# Altium project Flight Controller Core PCB Version.PrjPcb (part 1 of 2)
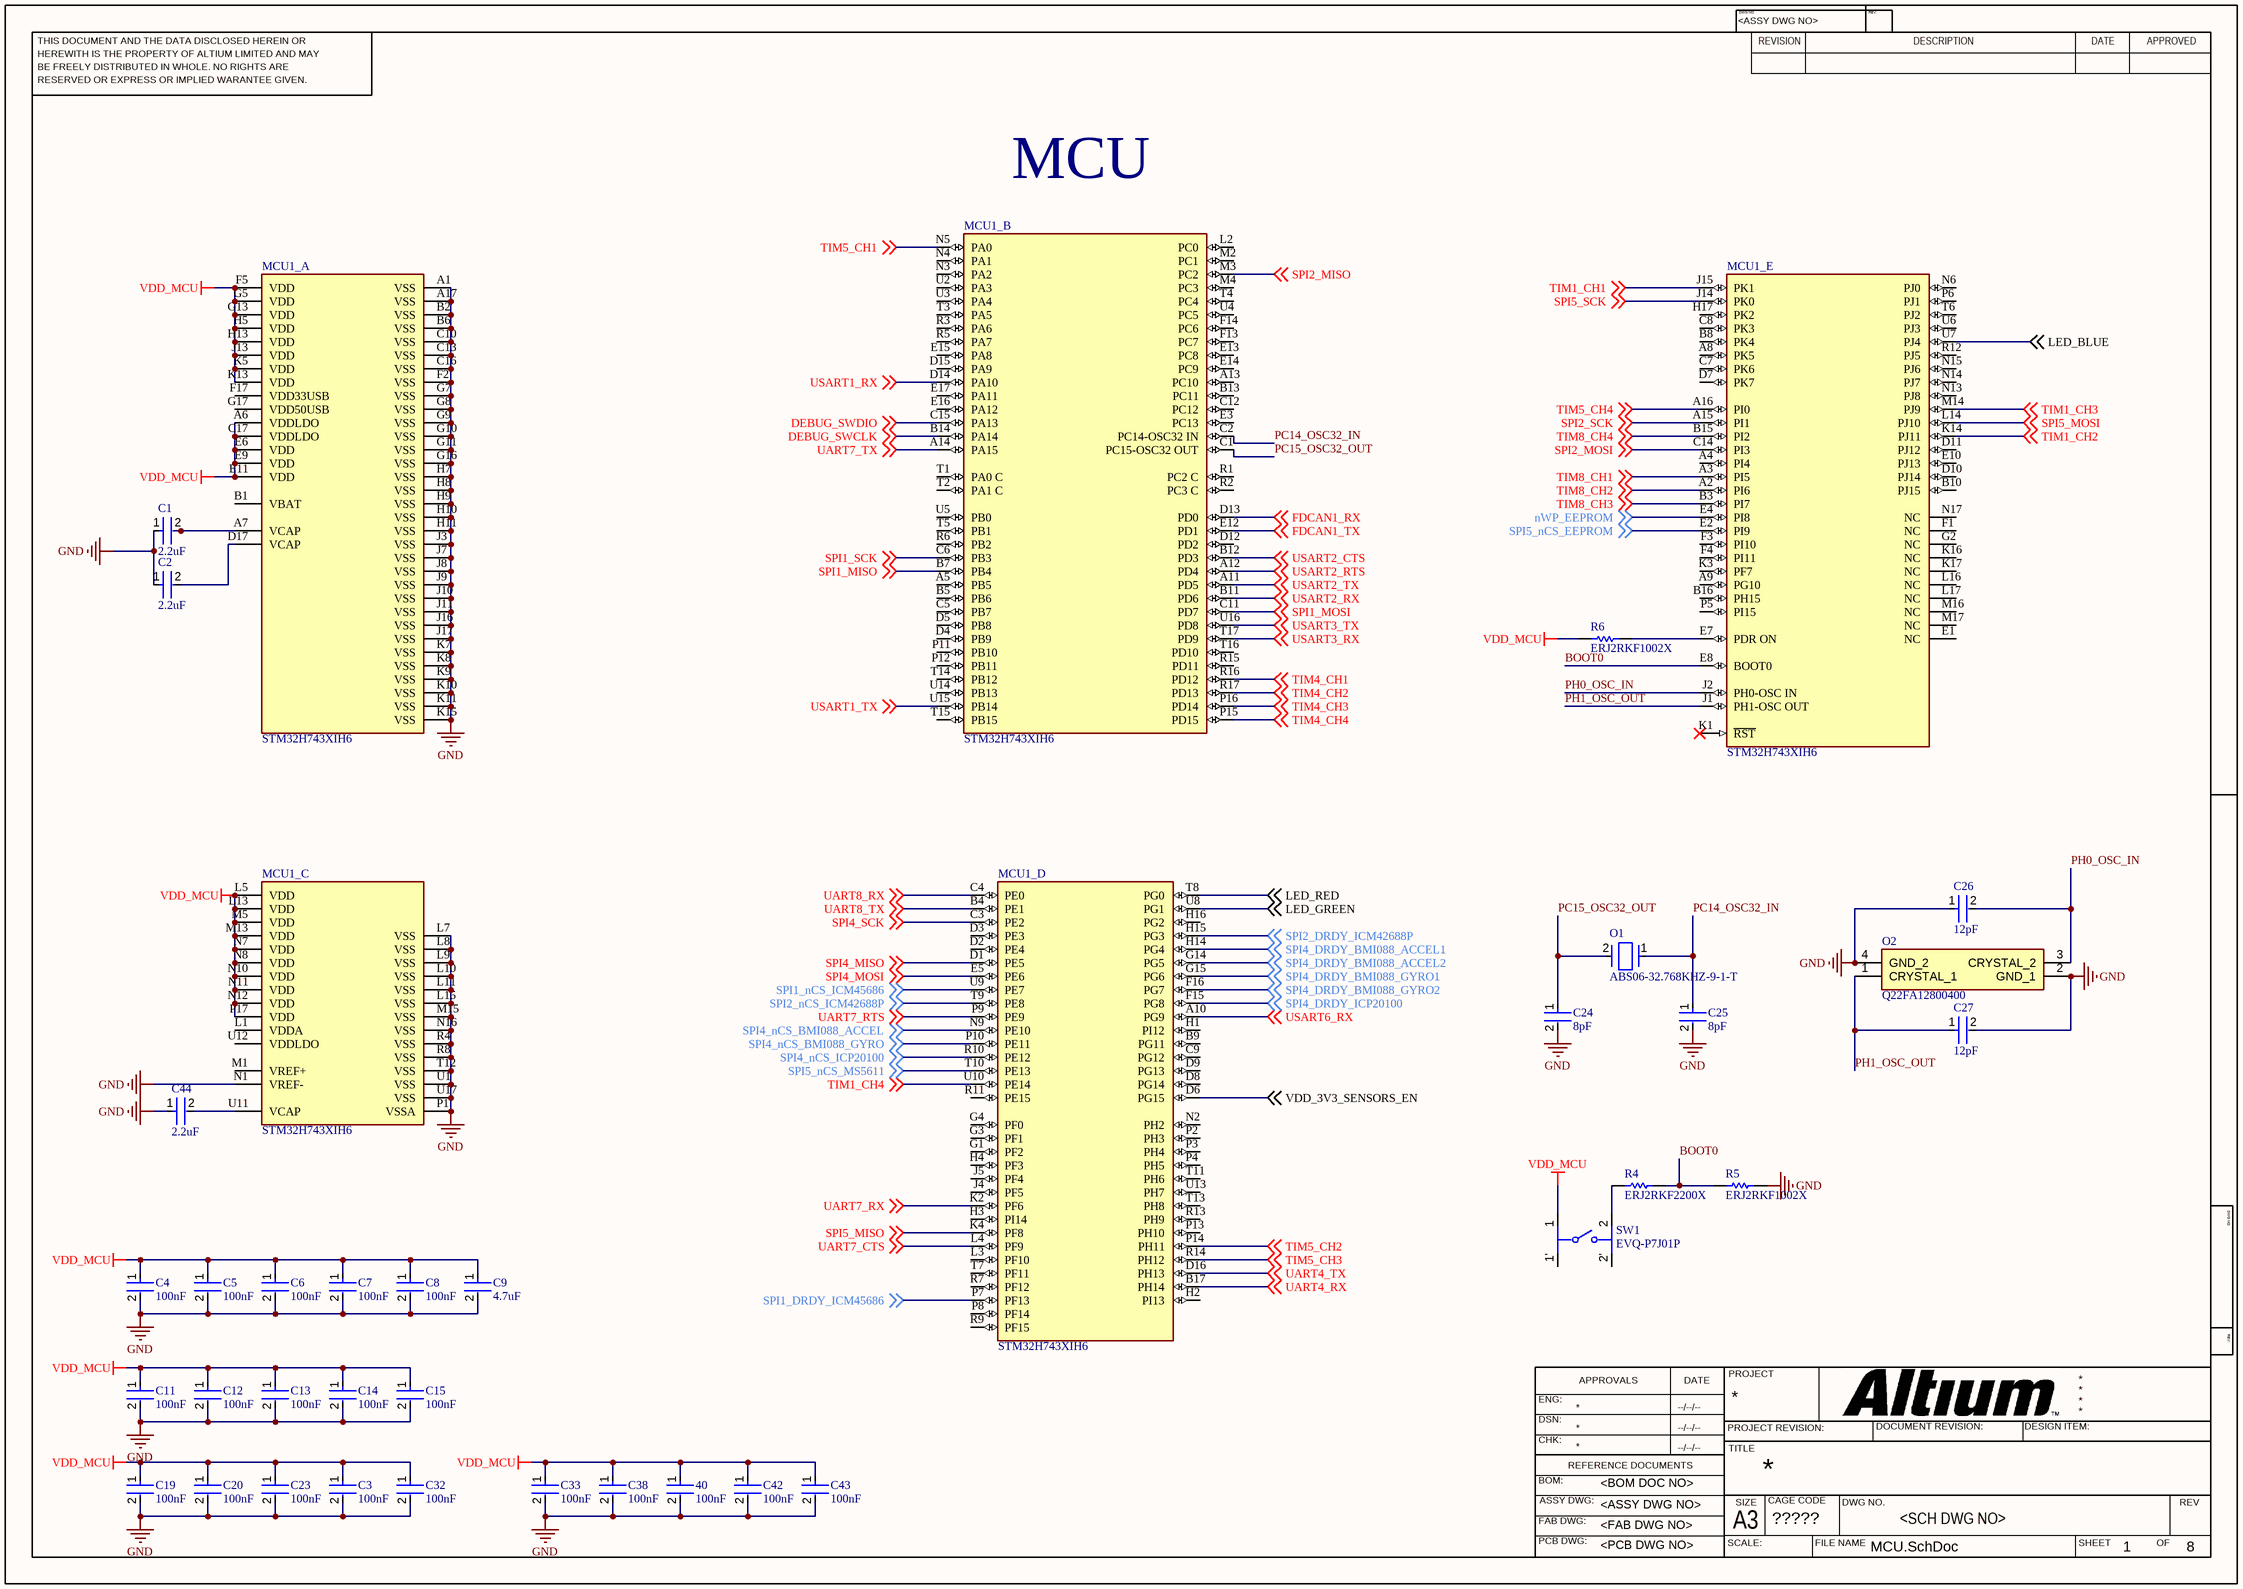
[diagram p0: MCU.SchDoc]
CAGE_CODE: ?????; CONTRACT_NUMBER: <CONTRACT NO>; DOC_NO_ASSY_DWG: <ASSY DWG NO>; DOC_NO_BOM: <BOM DOC NO>; DOC_NO_FAB_DWG: <FAB DWG NO>; DOC_NO_SCH_DWG: <SCH DWG NO>; PCB_2_DEC_TOL: +/-.01; PCB_3_DEC_TOL: +/-.010; PCB_ANG_TOL: +/-1/2; PCB_ASSEMBLY_NO: <PCB ASSY NO>; PCB_CHECKER: - -----; PCB_CHECKER_APP_DATE: --/--/----; PCB_DESIGNER: - -----; PCB_DESIGNER_APP_DATE: --/--/----; PCB_DWG_NO: <PCB DWG NO>; PCB_ENGINEER: - -----; PCB_ENGINEER_APP_DATE: --/--/----; PCB_PART_NUMBER: <PCB PN>; PCB_REV: A; SCH_REV: A
8 sheets, 82 parts. Net scope: global (net labels, ports and power ports of the same name join across sheets).
Board file: flight controller.PcbDoc
Sheets:
  MCU.SchDoc
  Power.SchDoc
  Imu.SchDoc
  Barometer.SchDoc
  Pwm.SchDoc
  Uart.SchDoc
  Can.SchDoc
  Connector.SchDoc

## Sheet MCU.SchDoc
size 420 x 297 mm; ENG_APP_DATE: --/--/--; DSN_APP_DATE: --/--/--; CHK_APP_DATE: --/--/--; ApprovedBy: HITESH; SheetNumber: 1; SheetTotal: 8

### Parts
40  100nF  [FP-CC0402-MFG]
C1  2.2uF  [FP-C1005-050-0_15-IPC_A]
C2  2.2uF  [FP-C1005-050-0_15-IPC_A]
C3  100nF  [FP-CC0402-MFG]
C4  100nF  [FP-CC0402-MFG]
C5  100nF  [FP-CC0402-MFG]
C6  100nF  [FP-CC0402-MFG]
C7  100nF  [FP-CC0402-MFG]
C8  100nF  [FP-CC0402-MFG]
C9  4.7uF  [FP-CC0402-MFG]
C11  100nF  [FP-CC0402-MFG]
C12  100nF  [FP-CC0402-MFG]
C13  100nF  [FP-CC0402-MFG]
C14  100nF  [FP-CC0402-MFG]
C15  100nF  [FP-CC0402-MFG]
C19  100nF  [FP-CC0402-MFG]
C20  100nF  [FP-CC0402-MFG]
C23  100nF  [FP-CC0402-MFG]
C24  8pF  [FP-GJM155-0_05-IPC_C]
C25  8pF  [FP-GJM155-0_05-IPC_C]
C26  12pF  [FP-GRM155-0_05-MFG]
C27  12pF  [FP-GRM155-0_05-MFG]
C32  100nF  [FP-CC0402-MFG]
C33  100nF  [FP-CC0402-MFG]
C38  100nF  [FP-CC0402-MFG]
C42  100nF  [FP-CC0402-MFG]
C43  100nF  [FP-CC0402-MFG]
C44  2.2uF  [FP-C1005-050-0_15-IPC_A]
MCU1_  STM32H743XIH6  [FP-TFBGA240+25-A07U-MFG]  (parts A,B,C,D,E of 5)
O1  ABS06-32.768KHZ-9-1-T  [FP-ABS06-MFG]
O2  Q22FA12800400  [Q22FA12800400]
R4  ERJ2RKF2200X  [RESC1005X40X25LL05T05]
R5  ERJ2RKF1002X  [RESC1005X40X25LL05T05]
R6  ERJ2RKF1002X  [RESC1005X40X25LL05T05]
SW1  EVQ-P7J01P  [FP-EVQ-P7J01P-MFG]

### Nets
GND: 40.2 C1.1 C2.1 C3.2 C4.2 C5.2 C6.2 C7.2 C8.2 C9.2 C11.2 C12.2 C13.2 C14.2 C15.2 C19.2 C20.2 C23.2 C24.2 C25.2 C26.1 C27.2 C32.2 C33.2 C38.2 C42.2 C43.2 C44.1 MCU1_.A1(VSS) MCU1_.A17(VSS) MCU1_.B2(VSS) MCU1_.B6(VSS) MCU1_.C10(VSS) MCU1_.C13(VSS) MCU1_.C16(VSS) MCU1_.F2(VSS) MCU1_.G7(VSS) MCU1_.G8(VSS) MCU1_.G9(VSS) MCU1_.G10(VSS) MCU1_.G11(VSS) MCU1_.G16(VSS) MCU1_.H7(VSS) MCU1_.H8(VSS) MCU1_.H9(VSS) MCU1_.H10(VSS) MCU1_.H11(VSS) MCU1_.J3(VSS) MCU1_.J7(VSS) MCU1_.J8(VSS) MCU1_.J9(VSS) MCU1_.J10(VSS) MCU1_.J11(VSS) MCU1_.J16(VSS) MCU1_.J17(VSS) MCU1_.K7(VSS) MCU1_.K8(VSS) MCU1_.K9(VSS) MCU1_.K10(VSS) MCU1_.K11(VSS) MCU1_.K15(VSS) MCU1_.L7(VSS) MCU1_.L8(VSS) MCU1_.L9(VSS) MCU1_.L10(VSS) MCU1_.L11(VSS) MCU1_.L15(VSS) MCU1_.M15(VSS) MCU1_.N1(VREF-) MCU1_.N16(VSS) MCU1_.P1(VSSA) MCU1_.R4(VSS) MCU1_.R8(VSS) MCU1_.T12(VSS) MCU1_.U1(VSS) MCU1_.U17(VSS) O2.2(GND_1) O2.4(GND_2) R5.1
VDD_MCU: 40.1 C3.1 C4.1 C5.1 C6.1 C7.1 C8.1 C9.1 C11.1 C12.1 C13.1 C14.1 C15.1 C19.1 C20.1 C23.1 C32.1 C33.1 C38.1 C42.1 C43.1 MCU1_.A6(VDDLDO) MCU1_.C17(VDDLDO) MCU1_.E6(VDD) MCU1_.E9(VDD) MCU1_.E11(VDD) MCU1_.F5(VDD) MCU1_.G5(VDD) MCU1_.G13(VDD) MCU1_.H5(VDD) MCU1_.H13(VDD) MCU1_.J13(VDD) MCU1_.K5(VDD) MCU1_.K13(VDD) MCU1_.L5(VDD) MCU1_.L13(VDD) MCU1_.M5(VDD) MCU1_.M13(VDD) MCU1_.N7(VDD) MCU1_.N8(VDD) MCU1_.N10(VDD) MCU1_.N11(VDD) MCU1_.N12(VDD) MCU1_.P17(VDD) R6.2 SW1.1
BOOT0: MCU1_.E8(BOOT0) R4.2 R5.2
DEBUG_SWCLK: MCU1_.B14(PA14) ; off-sheet DEBUG_SWCLK
DEBUG_SWDIO: MCU1_.C15(PA13) ; off-sheet DEBUG_SWDIO
FDCAN1_RX: MCU1_.D13(PD0) ; off-sheet FDCAN1_RX
FDCAN1_TX: MCU1_.E12(PD1) ; off-sheet FDCAN1_TX
LED_BLUE: MCU1_.U7(PJ4) ; off-sheet LED_BLUE
LED_GREEN: MCU1_.U8(PG1) ; off-sheet LED_GREEN
LED_RED: MCU1_.T8(PG0) ; off-sheet LED_RED
nWP_EEPROM: MCU1_.E4(PI8) ; off-sheet nWP_EEPROM
PC14_OSC32_IN: C25.1 MCU1_.C2(PC14-OSC32_IN) O1.1
PC15_OSC32_OUT: C24.1 MCU1_.C1(PC15-OSC32_OUT) O1.2
PH0_OSC_IN: C26.2 MCU1_.J2(PH0-OSC_IN) O2.3(CRYSTAL_2)
PH1_OSC_OUT: C27.1 MCU1_.J1(PH1-OSC_OUT) O2.1(CRYSTAL_1)
SPI1_DRDY_ICM45686: MCU1_.P7(PF13) ; off-sheet SPI1_DRDY_ICM45686
SPI1_MISO: MCU1_.B7(PB4) ; off-sheet SPI1_MISO
SPI1_MOSI: MCU1_.C11(PD7) ; off-sheet SPI1_MOSI
SPI1_nCS_ICM45686: MCU1_.U9(PE7) ; off-sheet SPI1_nCS_ICM45686
SPI1_SCK: MCU1_.C6(PB3) ; off-sheet SPI1_SCK
SPI2_DRDY_ICM42688P: MCU1_.H15(PG3) ; off-sheet SPI2_DRDY_ICM42688P
SPI2_MISO: MCU1_.M3(PC2) ; off-sheet SPI2_MISO
SPI2_MOSI: MCU1_.C14(PI3) ; off-sheet SPI2_MOSI
SPI2_nCS_ICM42688P: MCU1_.T9(PE8) ; off-sheet SPI2_nCS_ICM42688P
SPI2_SCK: MCU1_.A15(PI1) ; off-sheet SPI2_SCK
SPI4_DRDY_BMI088_ACCEL1: MCU1_.H14(PG4) ; off-sheet SPI4_DRDY_BMI088_ACCEL1
SPI4_DRDY_BMI088_ACCEL2: MCU1_.G14(PG5) ; off-sheet SPI4_DRDY_BMI088_ACCEL2
SPI4_DRDY_BMI088_GYRO1: MCU1_.G15(PG6) ; off-sheet SPI4_DRDY_BMI088_GYRO1
SPI4_DRDY_BMI088_GYRO2: MCU1_.F16(PG7) ; off-sheet SPI4_DRDY_BMI088_GYRO2
SPI4_DRDY_ICP20100: MCU1_.F15(PG8) ; off-sheet SPI4_DRDY_ICP20100
SPI4_MISO: MCU1_.D1(PE5) ; off-sheet SPI4_MISO
SPI4_MOSI: MCU1_.E5(PE6) ; off-sheet SPI4_MOSI
SPI4_nCS_BMI088_ACCEL: MCU1_.N9(PE10) ; off-sheet SPI4_nCS_BMI088_ACCEL
SPI4_nCS_BMI088_GYRO: MCU1_.P10(PE11) ; off-sheet SPI4_nCS_BMI088_GYRO
SPI4_nCS_ICP20100: MCU1_.R10(PE12) ; off-sheet SPI4_nCS_ICP20100
SPI4_SCK: MCU1_.C3(PE2) ; off-sheet SPI4_SCK
SPI5_MISO: MCU1_.K4(PF8) ; off-sheet SPI5_MISO
SPI5_MOSI: MCU1_.L14(PJ10) ; off-sheet SPI5_MOSI
SPI5_nCS_EEPROM: MCU1_.E2(PI9) ; off-sheet SPI5_nCS_EEPROM
SPI5_nCS_MS5611: MCU1_.T10(PE13) ; off-sheet SPI5_nCS_MS5611
SPI5_SCK: MCU1_.J14(PK0) ; off-sheet SPI5_SCK
TIM1_CH1: MCU1_.J15(PK1) ; off-sheet TIM1_CH1
TIM1_CH2: MCU1_.K14(PJ11) ; off-sheet TIM1_CH2
TIM1_CH3: MCU1_.M14(PJ9) ; off-sheet TIM1_CH3
TIM1_CH4: MCU1_.U10(PE14) ; off-sheet TIM1_CH4
TIM4_CH1: MCU1_.R16(PD12) ; off-sheet TIM4_CH1
TIM4_CH2: MCU1_.R17(PD13) ; off-sheet TIM4_CH2
TIM4_CH3: MCU1_.P16(PD14) ; off-sheet TIM4_CH3
TIM4_CH4: MCU1_.P15(PD15) ; off-sheet TIM4_CH4
TIM5_CH1: MCU1_.N5(PA0) ; off-sheet TIM5_CH1
TIM5_CH2: MCU1_.P14(PH11) ; off-sheet TIM5_CH2
TIM5_CH3: MCU1_.R14(PH12) ; off-sheet TIM5_CH3
TIM5_CH4: MCU1_.A16(PI0) ; off-sheet TIM5_CH4
TIM8_CH1: MCU1_.A3(PI5) ; off-sheet TIM8_CH1
TIM8_CH2: MCU1_.A2(PI6) ; off-sheet TIM8_CH2
TIM8_CH3: MCU1_.B3(PI7) ; off-sheet TIM8_CH3
TIM8_CH4: MCU1_.B15(PI2) ; off-sheet TIM8_CH4
UART4_RX: MCU1_.B17(PH14) ; off-sheet UART4_RX
UART4_TX: MCU1_.D16(PH13) ; off-sheet UART4_TX
UART7_CTS: MCU1_.L4(PF9) ; off-sheet UART7_CTS
UART7_RTS: MCU1_.P9(PE9) ; off-sheet UART7_RTS
UART7_RX: MCU1_.K2(PF6) ; off-sheet UART7_RX
UART7_TX: MCU1_.A14(PA15) ; off-sheet UART7_TX
UART8_RX: MCU1_.C4(PE0) ; off-sheet UART8_RX
UART8_TX: MCU1_.B4(PE1) ; off-sheet UART8_TX
USART1_RX: MCU1_.D14(PA10) ; off-sheet USART1_RX
USART1_TX: MCU1_.U15(PB14) ; off-sheet USART1_TX
USART2_CTS: MCU1_.B12(PD3) ; off-sheet USART2_CTS
USART2_RTS: MCU1_.A12(PD4) ; off-sheet USART2_RTS
USART2_RX: MCU1_.B11(PD6) ; off-sheet USART2_RX
USART2_TX: MCU1_.A11(PD5) ; off-sheet USART2_TX
USART3_RX: MCU1_.T17(PD9) ; off-sheet USART3_RX
USART3_TX: MCU1_.U16(PD8) ; off-sheet USART3_TX
USART6_RX: MCU1_.A10(PG9) ; off-sheet USART6_RX
VDD_3V3_SENSORS_EN: MCU1_.D6(PG15) ; off-sheet VDD_3V3_SENSORS_EN
NetC1_2: C1.2 MCU1_.A7(VCAP)
NetC2_2: C2.2 MCU1_.D17(VCAP)
NetC44_2: C44.2 MCU1_.U11(VCAP)
NetMCU1__E7: MCU1_.E7(PDR_ON) R6.1
NetR4_1: R4.1 SW1.2

Not connected (* = marked no-connect by the designer): MCU1_ A4(PI4) A5(PB5) A8(PK5) A9(PG10) A13(PC10) B1(VBAT) B5(PB6) B8(PK4) B9(PG11) B10(PJ15) B13(PC11) B16(PH15) C5(PB7) C7(PK6) C8(PK3) C9(PG12) C12(PC12) D2(PE4) D3(PE3) D4(PB9) D5(PB8) D7(PK7) D8(PG14) D9(PG13) D10(PJ14) D11(PJ12) D12(PD2) D15(PA9) E1(NC) E3(PC13) E10(PJ13) E13(PC8) E14(PC9) E15(PA8) E16(PA12) E17(PA11) F1(NC) F3(PI10) F4(PI11) F13(PC7) F14(PC6) F17(VDD33USB) G1(PF2) G2(NC) G3(PF1) G4(PF0) G17(VDD50USB) H1(PI12) H2(PI13) H3(PI14) H4(PF3) H16(PG2) H17(PK2) J4(PF5) J5(PF4) K1(~{RST})* K3(PF7) K16(NC) K17(NC) L1(VDDA) L2(PC0) L3(PF10) L16(NC) L17(NC) M1(VREF+) M2(PC1) M4(PC3) M16(NC) M17(NC) N2(PH2) N3(PA2) N4(PA1) N6(PJ0) N13(PJ8) N14(PJ7) N15(PJ6) N17(NC) P2(PH3) P3(PH4) P4(PH5) P5(PI15) P6(PJ1) P8(PF14) P11(PB10) P12(PB11) P13(PH10) R1(PC2_C) R2(PC3_C) R3(PA6) R5(PA7) R6(PB2) R7(PF12) R9(PF15) R11(PE15) R12(PJ5) R13(PH9) R15(PD11) T1(PA0_C) T2(PA1_C) T3(PA5) T4(PC4) T5(PB1) T6(PJ2) T7(PF11) T11(PH6) T13(PH8) T14(PB12) T15(PB15) T16(PD10) U2(PA3) U3(PA4) U4(PC5) U5(PB0) U6(PJ3) U12(VDDLDO) U13(PH7) U14(PB13); SW1 1' 2'

### Notes on the sheet
- MCU
- THIS DOCUMENT AND THE DATA DISCLOSED HEREIN OR
- HEREWITH IS THE PROPERTY OF ALTIUM LIMITED AND MAY
- DWG NO:
- REVISION
- REV:
- DESCRIPTION
- DATE
- APPROVED
- BE FREELY DISTRIBUTED IN WHOLE. NO RIGHTS ARE
- RESERVED OR EXPRESS OR IMPLIED WARANTEE GIVEN.
- ENG:
- APPROVALS
- PROJECT
- DSN:
- CHK:
- REFERENCE DOCUMENTS
- PROJECT REVISION:
- TITLE
- DOCUMENT REVISION:
- DESIGN ITEM:
- BOM:
- FAB DWG:
- PCB DWG:
- ASSY DWG:
- SCALE:
- A3
- SIZE
- CAGE CODE
- FILE NAME
- DWG NO.
- SHEET
- OF
- REV

### Library data of the parts
40 = CMP-03422-001121-1: CAP CER 0.1UF 16V X7R 0402; Manufacturer: YAGEO; Manufacturer Part Number: CC0402KPX7R7BB104; Temperature Coefficient: 30ppm/°C; Automotive Grade: NA; Tolerance: 0.1; Digikey Description: CAP CER 0.1UF 16V X7R 0402; Temperature Range Low: -55°C; Footprint Url: http://www.yageo.com/exep/pages/download/literatures/UPY-C_GEN_24.pdf; RoHS: TRUE; Material: Ceramic; Device Class L3: Ceramic Capacitors; Temperature Characteristic: X7R; Capacitance: 100 nF; Package: CC0402; Device Class L1: Passive Components; Lead Free: Yes; Temperature Range High: +125°C; Category: Cap; Mouser Description: 0402 0.1 uF 16 V ±10% Tolerance X7R SMT Multilayer Ceramic Capacitor; Voltage Rating: 16 V; Value: 100 nF; ComponentLink2Description: Datasheet; Automotive: No; Octopart: https://octopart.com/cc0402kpx7r7bb104-yageo-21548559; ComponentLink2URL: http://www.yageo.com/documents/recent/UPY-GP_NP0_16V-to-50V_16.pdf; Height: 0.55mm; Device Class L2: Capacitors; Temperature: -55°C to +125°C; Ipc Land Pattern Name: CAPC10050X50
C1 C2 C44 = CMP-08246-007153-1: CAP CER 2.2UF 35V X5R 0402; Dielectric Material: Ceramic; Tolerance: 10%; Package Quantity: 1; Voltage Rating: 35V; Case Code (Metric): 1005; Width: 0.5mm; RoHS Compliant: Yes; Capacitance: 2.2uF; Min Operating Temperature: -55°C; Packaging: Tape and Reel; Voltage Rating (DC): 35V; Thickness: 0.022inch; REACH SVHC: No SVHC; Max Operating Temperature: 85°C; Length: 1mm; Case Code (Imperial): 0402; Resistor Type: Ceramic; Lead Free: Lead Free; Series: C; Termination: SMD/SMT; Height: 0.5mm; Mount: Surface Mount; Case/Package: 0402; Weight: 2.3E-05oz; Dielectric: X5R; Depth: 0.5mm
C3-C8 C11-C15 C19 C20 C23 C32 C33 C38 C42 C43 = CMP-03422-001121-1: CAP CER 0.1UF 16V X7R 0402; Manufacturer: YAGEO; Manufacturer Part Number: CC0402KPX7R7BB104; Material: Ceramic; Temperature Coefficient: 30ppm/°C; Automotive Grade: NA; Tolerance: 0.1; Digikey Description: CAP CER 0.1UF 16V X7R 0402; Temperature Range Low: -55°C; Footprint Url: http://www.yageo.com/exep/pages/download/literatures/UPY-C_GEN_24.pdf; RoHS: TRUE; Device Class L3: Ceramic Capacitors; Temperature Characteristic: X7R; Capacitance: 100 nF; Package: CC0402; Device Class L1: Passive Components; Lead Free: Yes; Temperature Range High: +125°C; Category: Cap; Mouser Description: 0402 0.1 uF 16 V ±10% Tolerance X7R SMT Multilayer Ceramic Capacitor; Voltage Rating: 16 V; Value: 100 nF; ComponentLink2Description: Datasheet; Automotive: No; Octopart: https://octopart.com/cc0402kpx7r7bb104-yageo-21548559; ComponentLink2URL: http://www.yageo.com/documents/recent/UPY-GP_NP0_16V-to-50V_16.pdf; Height: 0.55mm; Device Class L2: Capacitors; Temperature: -55°C to +125°C; Ipc Land Pattern Name: CAPC10050X50
C9 = CMP-1034-02137-2: CAP CER 4.7UF 6.3V X5R 0402; Manufacturer: YAGEO; Manufacturer Part Number: CC0402MRX5R5BB475; Temperature Coefficient: 30ppm/°C; Tolerance: 0.2; Automotive Grade: NA; Material: Ceramic; Automotive: No; Temperature: -55°C to +125°C; Category: Cap; Ipc Land Pattern Name: CAPC10050X50; Digikey Description: CAP CER 4.7UF 6.3V X5R 0402; ComponentLink2Description: Datasheet; Octopart: https://octopart.com/cc0402mrx5r5bb475-yageo-20021081; Mouser Description: Multilayer Ceramic Capacitors MLCC - SMD/SMT 4.7uF 6.3V X5R 20%; Device Class L1: Passive Components; Footprint Url: http://www.yageo.com/exep/pages/download/literatures/UPY-C_GEN_24.pdf; Value: 4.7 uF; Temperature Range High: +125°C; ComponentLink2URL: http://www.yageo.com/documents/recent/UPY-GP_NP0_16V-to-50V_16.pdf; Voltage Rating: 6.3 V; Height: 0.55mm; RoHS: TRUE; Package: CC0402; Device Class L3: Ceramic Capacitors; Temperature Characteristic: X5R; Temperature Range Low: -55°C; Capacitance: 4.7 uF; Device Class L2: Capacitors; Lead Free: Yes
C24 C25 = CMP-2008-03759-2: Multi-Layer Ceramic Capacitor 8pF C0G  ±0.25pF 0402 Paper T/R; Voltage Rating (DC): 50V; Termination: SMD/SMT; Dielectric: C0G; Packaging: Tape and Reel; Width: 0.02inch; Thickness: 0.022inch; Case Code (Imperial): 0402; Min Operating Temperature: -55°C; Case Code (Metric): 1005; Voltage Rating: 50V; Capacitance: 8pF; Package Quantity: 1; Lead Free: Lead Free; Max Operating Temperature: 125°C; Mount: Surface Mount; Depth: 0.5mm; Height: 0.5mm; Radiation Hardening: No; Case/Package: 0402; Length: 1mm
C26 C27 = CMP-2008-03945-2: CAP CER 12PF 50V C0G/NP0 0402; Tolerance: 2%; Dielectric: C0G; Material: Ceramic; Termination: SMD/SMT; Mount: Surface Mount; REACH SVHC: No SVHC; Depth: 0.5mm; Case Code (Metric): 1005; Voltage Rating: 50V; Height: 0.5mm; Voltage Rating (DC): 50V; Case Code (Imperial): 0402; Package Quantity: 10000; Construction: Flat; Thickness: 0.022inch; Length: 1mm; Min Operating Temperature: -55°C; Width: 0.5mm; Lead Free: Lead Free; Capacitance: 12pF; Case/Package: 0402; Packaging: Tape and Reel; Series: GRM; Voltage: 50V; Radiation Hardening: No; Max Operating Temperature: 125°C
MCU1_ = CMP-12105-000122-1: IC MCU 32BIT 2MB FLASH TFBGA; Number of I/Os: 168; Core Architecture: ARM; Frequency: 400MHz; Oscillator Type: Internal; Interface: I2C; Peripherals: Brown-out Detect/Reset; Memory Type: FLASH; Packaging: Tray; Min Operating Temperature: -40°C; Max Operating Temperature: 85°C; Memory Size: 2MB; Case/Package: TFBGA; RoHS Compliant: Yes
O1 = CMP-27762-003430-2: Crystal 32.768kHz ±10ppm (Tol) 9pF FUND 90kΩ 2-Pin Mini-CSMD T/R; Series Resistance: 90kR; Series: ABS06; Case/Package: CSMD; Package Quantity: 3000; Load Capacitance: 9pF; Number of Pins: 2; Tolerance: 10ppm; RoHS Compliant: Yes; Depth: 1.2mm; Termination: SMD/SMT; Min Operating Temperature: -40°C; Length: 2mm; Packaging: Tape and Reel; Max Operating Temperature: 85°C; Frequency Tolerance: 10ppm; Width: 1.2mm; ESR (Equivalent Series Resistance): 90kR; Radiation Hardening: No; Frequency: 32.768kHz; REACH SVHC: No SVHC; Mount: Surface Mount; Height: 0.6mm
O2 = Q22FA12800400: Crystal or Oscillator; Manufacturer_Name: Seiko Epson Corporation; Datasheet Link: https://datasheet.lcsc.com/szlcsc/Seiko-Epson-Q22FA12800400_C255875.pdf; Height: 0.5mm; Manufacturer_Part_Number: Q22FA12800400
R4 = CMP-2002-01131-1: Manufacturer: Panasonic; Part Number: ERJ2RKF2200X
R5 R6 = CMP-2000-07588-1: Chip Resistor, 10 KOhm, +/- 1%, 0.1 W, -55 to 155 degC, 0402 (1005 Metric), RoHS, Tape and Reel; Manufacturer: Panasonic; Power Rating: 100mW; Voltage Rating: 50V; Resistance: 10KOhm; Case\/Package: 0402; Temperature Coefficient: 100ppm\/degreesC; RoHSCompliant: True; Lead Free: LeadFree; Package Quantity: 1; Contact Plating: Tin; Length: 1mm; Radiation Hardening: No; REACH SVHC: NoSVHC; Max Operating Temperature: 155degC; Depth: 0.5mm; Case Code (Imperial): 0402; Military Standard: Not; Package Description: 2-Pin Surface Mount Device, Body 1 x 0.5 mm; Termination: SMD/SMT; Case Code (Metric): 1005; Height: 0.35mm; Packaging: TapeandReel; Voltage Rating (DC): 50V; Package Reference: 402; Number of Pins: 2; Tolerance: 1%; Mounting Technology: SurfaceMount; Width: 0.02inch; Mount: SurfaceMount; Datasheet URL: https://industrial.panasonic.com/cdbs/www-data/pdf/RDA0000/AOA0000C304.pdf; Composition: ThickFilm; Datasheet Version: 02/2017; Manufacturer URL: http://www.panasonic.com/; Max Power Dissipation: 100mW; Number of Terminations: 2; Min Operating Temperature: -55degC
SW1 = CMP-05618-000001-1: SWITCH TACTILE SPST-NO 0.05A 12V; Manufacturer: Panasonic; Operating Force: 1.6N; Contact Current Rating: 50mA; Electromechanical Life: 100000Cycles; Contact Resistance: 500mΩ; Height: 1.55mm; Temperature Range Low: -20°C; Device Class L1: Electromechanical; Package: 0; RoHS: TRUE; Category: Switch; ComponentLink2Description: Datasheet; Device Class L2: Switches; Temperature Range High: +70°C; Mount: Surface Mount; Device Class L3: Tactile Switches; Temperature: -20°C to +70°C; Automotive: No; Manufacturer Part Number: EVQ-P7J01P; Mouser Description: Tactile Switches 3.5x2.9mm Right Ang Light Touch Switch; ComponentLink2URL: https://b2b-api.panasonic.eu/file_stream/pids/fileversion/2431; Lead Free: Yes; Octopart: https://octopart.com/evq-p7j01p-panasonic-29917078; Digikey Description: SWITCH TACTILE SPST-NO 0.05A 12V; Voltage Rating Dc: 12V; Throw Configuration: SPST-NO

## Sheet Power.SchDoc
size 420 x 297 mm; SheetNumber: 2; SheetTotal: 8
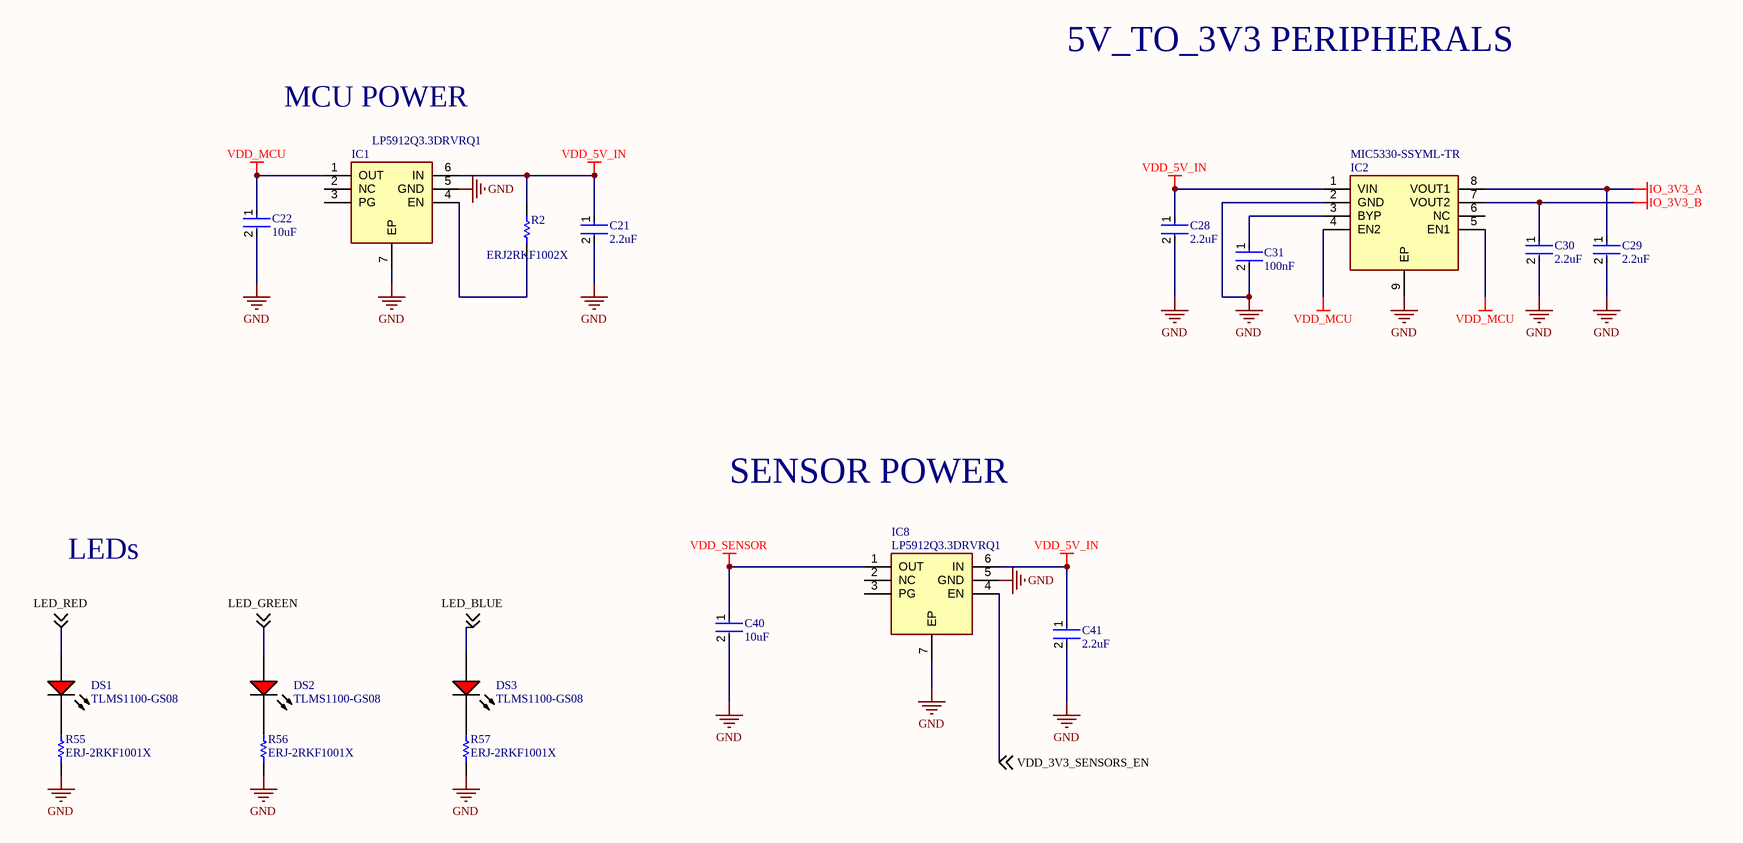
[diagram p1: Power.SchDoc]

### Parts
C21  2.2uF  [FP-C1005-050-0_15-IPC_A]
C22  10uF  [FP-GRM18-0_15-MFG]
C28  2.2uF  [FP-C1005-050-0_15-IPC_A]
C29  2.2uF  [FP-C1005-050-0_15-IPC_A]
C30  2.2uF  [FP-C1005-050-0_15-IPC_A]
C31  100nF  [FP-CC0402-MFG]
C40  10uF  [FP-GRM18-0_15-MFG]
C41  2.2uF  [FP-C1005-050-0_15-IPC_A]
DS1  TLMS1100-GS08  [VISH-TLMX1100_V]
DS2  TLMS1100-GS08  [VISH-TLMX1100_V]
DS3  TLMS1100-GS08  [VISH-TLMX1100_V]
IC1  LP5912Q3.3DRVRQ1  [SON65P200X200X80-7N]
IC2  MIC5330-SSYML-TR  [SON50P200X200X95-9N-D]
IC8  LP5912Q3.3DRVRQ1  [SON65P200X200X80-7N]
R2  ERJ2RKF1002X  [RESC1005X40X25LL05T05]
R55  ERJ-2RKF1001X  [RESC1005X40X25NL05T05]
R56  ERJ-2RKF1001X  [RESC1005X40X25NL05T05]
R57  ERJ-2RKF1001X  [RESC1005X40X25NL05T05]

### Nets
GND: C21.2 C22.2 C28.2 C29.2 C30.2 C31.2 C40.2 C41.2 IC1.5(GND) IC1.7(EP) IC2.2(GND) IC2.9(EP) IC8.5(GND) IC8.7(EP) R55.1 R56.1 R57.1
IO_3V3_A: C29.1 IC2.8(VOUT1)
IO_3V3_B: C30.1 IC2.7(VOUT2)
VDD_5V_IN: C21.1 C28.1 C41.1 IC1.6(IN) IC2.1(VIN) IC8.6(IN) R2.2
VDD_MCU: C22.1 IC1.1(OUT) IC2.4(EN2) IC2.5(EN1)
VDD_SENSOR: C40.1 IC8.1(OUT)
LED_BLUE: DS3.1(A) ; off-sheet LED_BLUE
LED_GREEN: DS2.1(A) ; off-sheet LED_GREEN
LED_RED: DS1.1(A) ; off-sheet LED_RED
VDD_3V3_SENSORS_EN: IC8.4(EN) ; off-sheet VDD_3V3_SENSORS_EN
NetC31_1: C31.1 IC2.3(BYP)
NetDS1_2: DS1.2(K) R55.2
NetDS2_2: DS2.2(K) R56.2
NetDS3_2: DS3.2(K) R57.2
NetIC1_4: IC1.4(EN) R2.1

Not connected (* = marked no-connect by the designer): IC1 2(NC) 3(PG); IC2 6(NC); IC8 2(NC) 3(PG)

### Notes on the sheet
- 5V_TO_3V3 PERIPHERALS
- MCU POWER
- SENSOR POWER
- LEDs
- THIS DOCUMENT AND THE DATA DISCLOSED HEREIN OR
- HEREWITH IS THE PROPERTY OF ALTIUM LIMITED AND MAY
- DWG NO:
- REVISION
- REV:
- DESCRIPTION
- DATE
- APPROVED
- BE FREELY DISTRIBUTED IN WHOLE. NO RIGHTS ARE
- RESERVED OR EXPRESS OR IMPLIED WARANTEE GIVEN.
- ENG:
- APPROVALS
- PROJECT
- DSN:
- CHK:
- REFERENCE DOCUMENTS
- PROJECT REVISION:
- TITLE
- DOCUMENT REVISION:
- DESIGN ITEM:
- BOM:
- FAB DWG:
- PCB DWG:
- ASSY DWG:
- SCALE:
- A3
- SIZE
- CAGE CODE
- FILE NAME
- DWG NO.
- SHEET
- OF
- REV

### Library data of the parts
C21 C28-C30 C41 = CMP-08246-007153-1: as C1 on sheet MCU; Package Quantity: 1; Voltage Rating: 35V; Case Code (Metric): 1005; Width: 0.5mm; RoHS Compliant: Yes; Capacitance: 2.2uF; Min Operating Temperature: -55°C; Packaging: Tape and Reel; Voltage Rating (DC): 35V; Thickness: 0.022inch; REACH SVHC: No SVHC; Max Operating Temperature: 85°C; Length: 1mm; Case Code (Imperial): 0402; Resistor Type: Ceramic; Lead Free: Lead Free; Series: C; Termination: SMD/SMT; Height: 0.5mm; Mount: Surface Mount; Case/Package: 0402; Weight: 2.3E-05oz; Dielectric: X5R; Depth: 0.5mm
C22 C40 = CMP-2000-05448-2: CAP CER 10UF 10V X5R 0603; Manufacturer Part Number: GRM188R61A106KE69D; Manufacturer: Murata; Temperature Coefficient: 15%; Material: Ceramic; Tolerance: 10%; Device Class L1: Passive Components; ComponentLink2Description: Datasheet; Height: 0.95mm; Package: GRM18-0.15; Octopart: https://octopart.com/grm188r61a106ke69d-murata-22851381; Value: 10uF; Digikey Description: CAP CER 10UF 10V X5R 0603; Temperature Range High: +85°C; Temperature Range Low: -55°C; Temperature Characteristic: X5R; Capacitance: 10uF; RoHS: TRUE; Device Class L2: Capacitors; ComponentLink2URL: https://search.murata.co.jp/Ceramy/image/img/A01X/G101/ENG/GRM188R61A106KE69-01A.pdf; Device Class L3: Ceramic Capacitors; Lead Free: Yes; Mouser Description: Multilayer Ceramic Capacitors MLCC - SMD/SMT 0603 10uF 10volts X5R + - 10%; Category: Cap; Voltage Rating: 10V; Temperature: -55°C to +85°C; Automotive: No
C31 = CMP-03422-001121-1: as C3 on sheet MCU; Digikey Description: CAP CER 0.1UF 16V X7R 0402; Temperature Range Low: -55°C; Footprint Url: http://www.yageo.com/exep/pages/download/literatures/UPY-C_GEN_24.pdf; RoHS: TRUE; Device Class L3: Ceramic Capacitors; Temperature Characteristic: X7R; Capacitance: 100 nF; Package: CC0402; Device Class L1: Passive Components; Lead Free: Yes; Temperature Range High: +125°C; Category: Cap; Mouser Description: 0402 0.1 uF 16 V ±10% Tolerance X7R SMT Multilayer Ceramic Capacitor; Voltage Rating: 16 V; Value: 100 nF; ComponentLink2Description: Datasheet; Automotive: No; Octopart: https://octopart.com/cc0402kpx7r7bb104-yageo-21548559; ComponentLink2URL: http://www.yageo.com/documents/recent/UPY-GP_NP0_16V-to-50V_16.pdf; Height: 0.55mm; Device Class L2: Capacitors; Temperature: -55°C to +125°C; Ipc Land Pattern Name: CAPC10050X50
DS1-DS3 = CMP-1666-00027-1: LED, RED, 2.1 V, -40 to 100 degC, 2-Pin SMD (0603), RoHS, Tape and Reel; Type (Capacitors): C0G; Resistance: 100000000000 Ohm; Capacitance: 12 pF; Voltage Rating: 50 V; Tolerance: 5%; Min Operating Temperature: -55degC; REACH SVHC: No SVHC; ComponentLink2Description: Datasheet; ComponentLink1URL: http://www.vishay.com/; Width: 0.8 mm; Package Quantity: 4000; PackageReference: TLMX1100; ComponentLink2URL: http://www.vishay.com/docs/83173/tlmb1100.pdf; Case/Package: 0603; Case Code (Metric): 1608; Packaging: Tape and Reel; Pins: 2; ComponentLink1Description: Manufacturer URL; Max Operating Temperature: 125degC; Height: 0.8 mm; Length: 1.6 mm; Mount: Surface Mount; PackageDescription: 2-Pin Surface Mount Device, Body 1.6 x 0.8 mm; DatasheetVersion: Rev. 2.7, 03/2016; Case Code (Imperial): 0603; Voltage Rating (DC): 50 V; RoHSCompliant: True; Radiation Hardening: No
IC1 IC8 = LP5912Q3.3DRVRQ1: Integrated Circuit; Manufacturer_Name: Texas Instruments; Datasheet Link: http://www.ti.com/lit/gpn/lp5912-q1; Height: 0.8mm; Manufacturer_Part_Number: LP5912Q3.3DRVRQ1; Mouser Part Number: 595-LP5912Q3.3DRVRQ1; Mouser Price/Stock: https://www.mouser.co.uk/ProductDetail/Texas-Instruments/LP5912Q3.3DRVRQ1?qs=n%252BTO0c4TDSb%252BK5JhyfAoLw%3D%3D
IC2 = MIC5330-SSYML-TR: Integrated Circuit; Manufacturer_Name: Microchip; Datasheet Link: http://www.microchip.com/mymicrochip/filehandler.aspx?ddocname=en579824; Height: 0.95mm; Manufacturer_Part_Number: MIC5330-SSYML-TR; Mouser Part Number: 998-MIC5330-SSYMLTR; Mouser Price/Stock: https://www.mouser.co.uk/ProductDetail/Microchip-Technology/MIC5330-SSYML-TR?qs=U6T8BxXiZAVlV%252Bccuslf5g%3D%3D; Arrow Part Number: MIC5330-SSYML-TR; Arrow Price/Stock: https://www.arrow.com/en/products/mic5330-ssyml-tr/microchip-technology?region=nac
R2 = CMP-2000-07588-1: as R5 on sheet MCU; RoHSCompliant: True; Lead Free: LeadFree; Package Quantity: 1; Contact Plating: Tin; Length: 1mm; Radiation Hardening: No; REACH SVHC: NoSVHC; Max Operating Temperature: 155degC; Depth: 0.5mm; Case Code (Imperial): 0402; Military Standard: Not; Package Description: 2-Pin Surface Mount Device, Body 1 x 0.5 mm; Termination: SMD/SMT; Case Code (Metric): 1005; Height: 0.35mm; Packaging: TapeandReel; Voltage Rating (DC): 50V; Package Reference: 402; Number of Pins: 2; Tolerance: 1%; Mounting Technology: SurfaceMount; Width: 0.02inch; Mount: SurfaceMount; Datasheet URL: https://industrial.panasonic.com/cdbs/www-data/pdf/RDA0000/AOA0000C304.pdf; Composition: ThickFilm; Datasheet Version: 02/2017; Manufacturer URL: http://www.panasonic.com/; Max Power Dissipation: 100mW; Number of Terminations: 2; Min Operating Temperature: -55degC
R55-R57 = CMP-1011-00510-4: Chip Resistor, 1 KOhm, +/- 1%, 100 mW, -55 to 155 degC, 0402 (1005 Metric), RoHS, Tape and Reel; Manufacturer: Basic Passives; Voltage Rating: 50 V; Case\/Package: 0402; Resistance: 1 KOhm; Power Rating: 100 mW; PartNumber: ERJ-2RKF1001X; DatasheetVersion: 04/2015; Radiation Hardening: No; Pins: 2; Height: 0.35 mm; RoHSCompliant: true; Case Code (Imperial): 0402; ComponentLink2Description: Datasheet; ComponentLink1Description: Manufacturer URL; PackageReference: 0402; Mount: Surface Mount; Package Quantity: 10000; Tolerance: 1%; ComponentLink1URL: http://www.panasonic.com/; PackageDescription: 2-Pin Surface Mount Device, Body 1 x 0.5 mm; Mounting Technology: Surface Mount; Case Code (Metric): 1005; ComponentLink2URL: http://industrial.panasonic.com/cdbs/www-data/pdf/RDA0000/AOA0000C86.pdf; REACH SVHC: Yes; Packaging: Tape and Reel; Max Operating Temperature: 155 degC; Min Operating Temperature: -55 degC; Width: 0.5 mm; Length: 1 mm

## Sheet Imu.SchDoc
size 420 x 297 mm; SheetNumber: 3; SheetTotal: 8
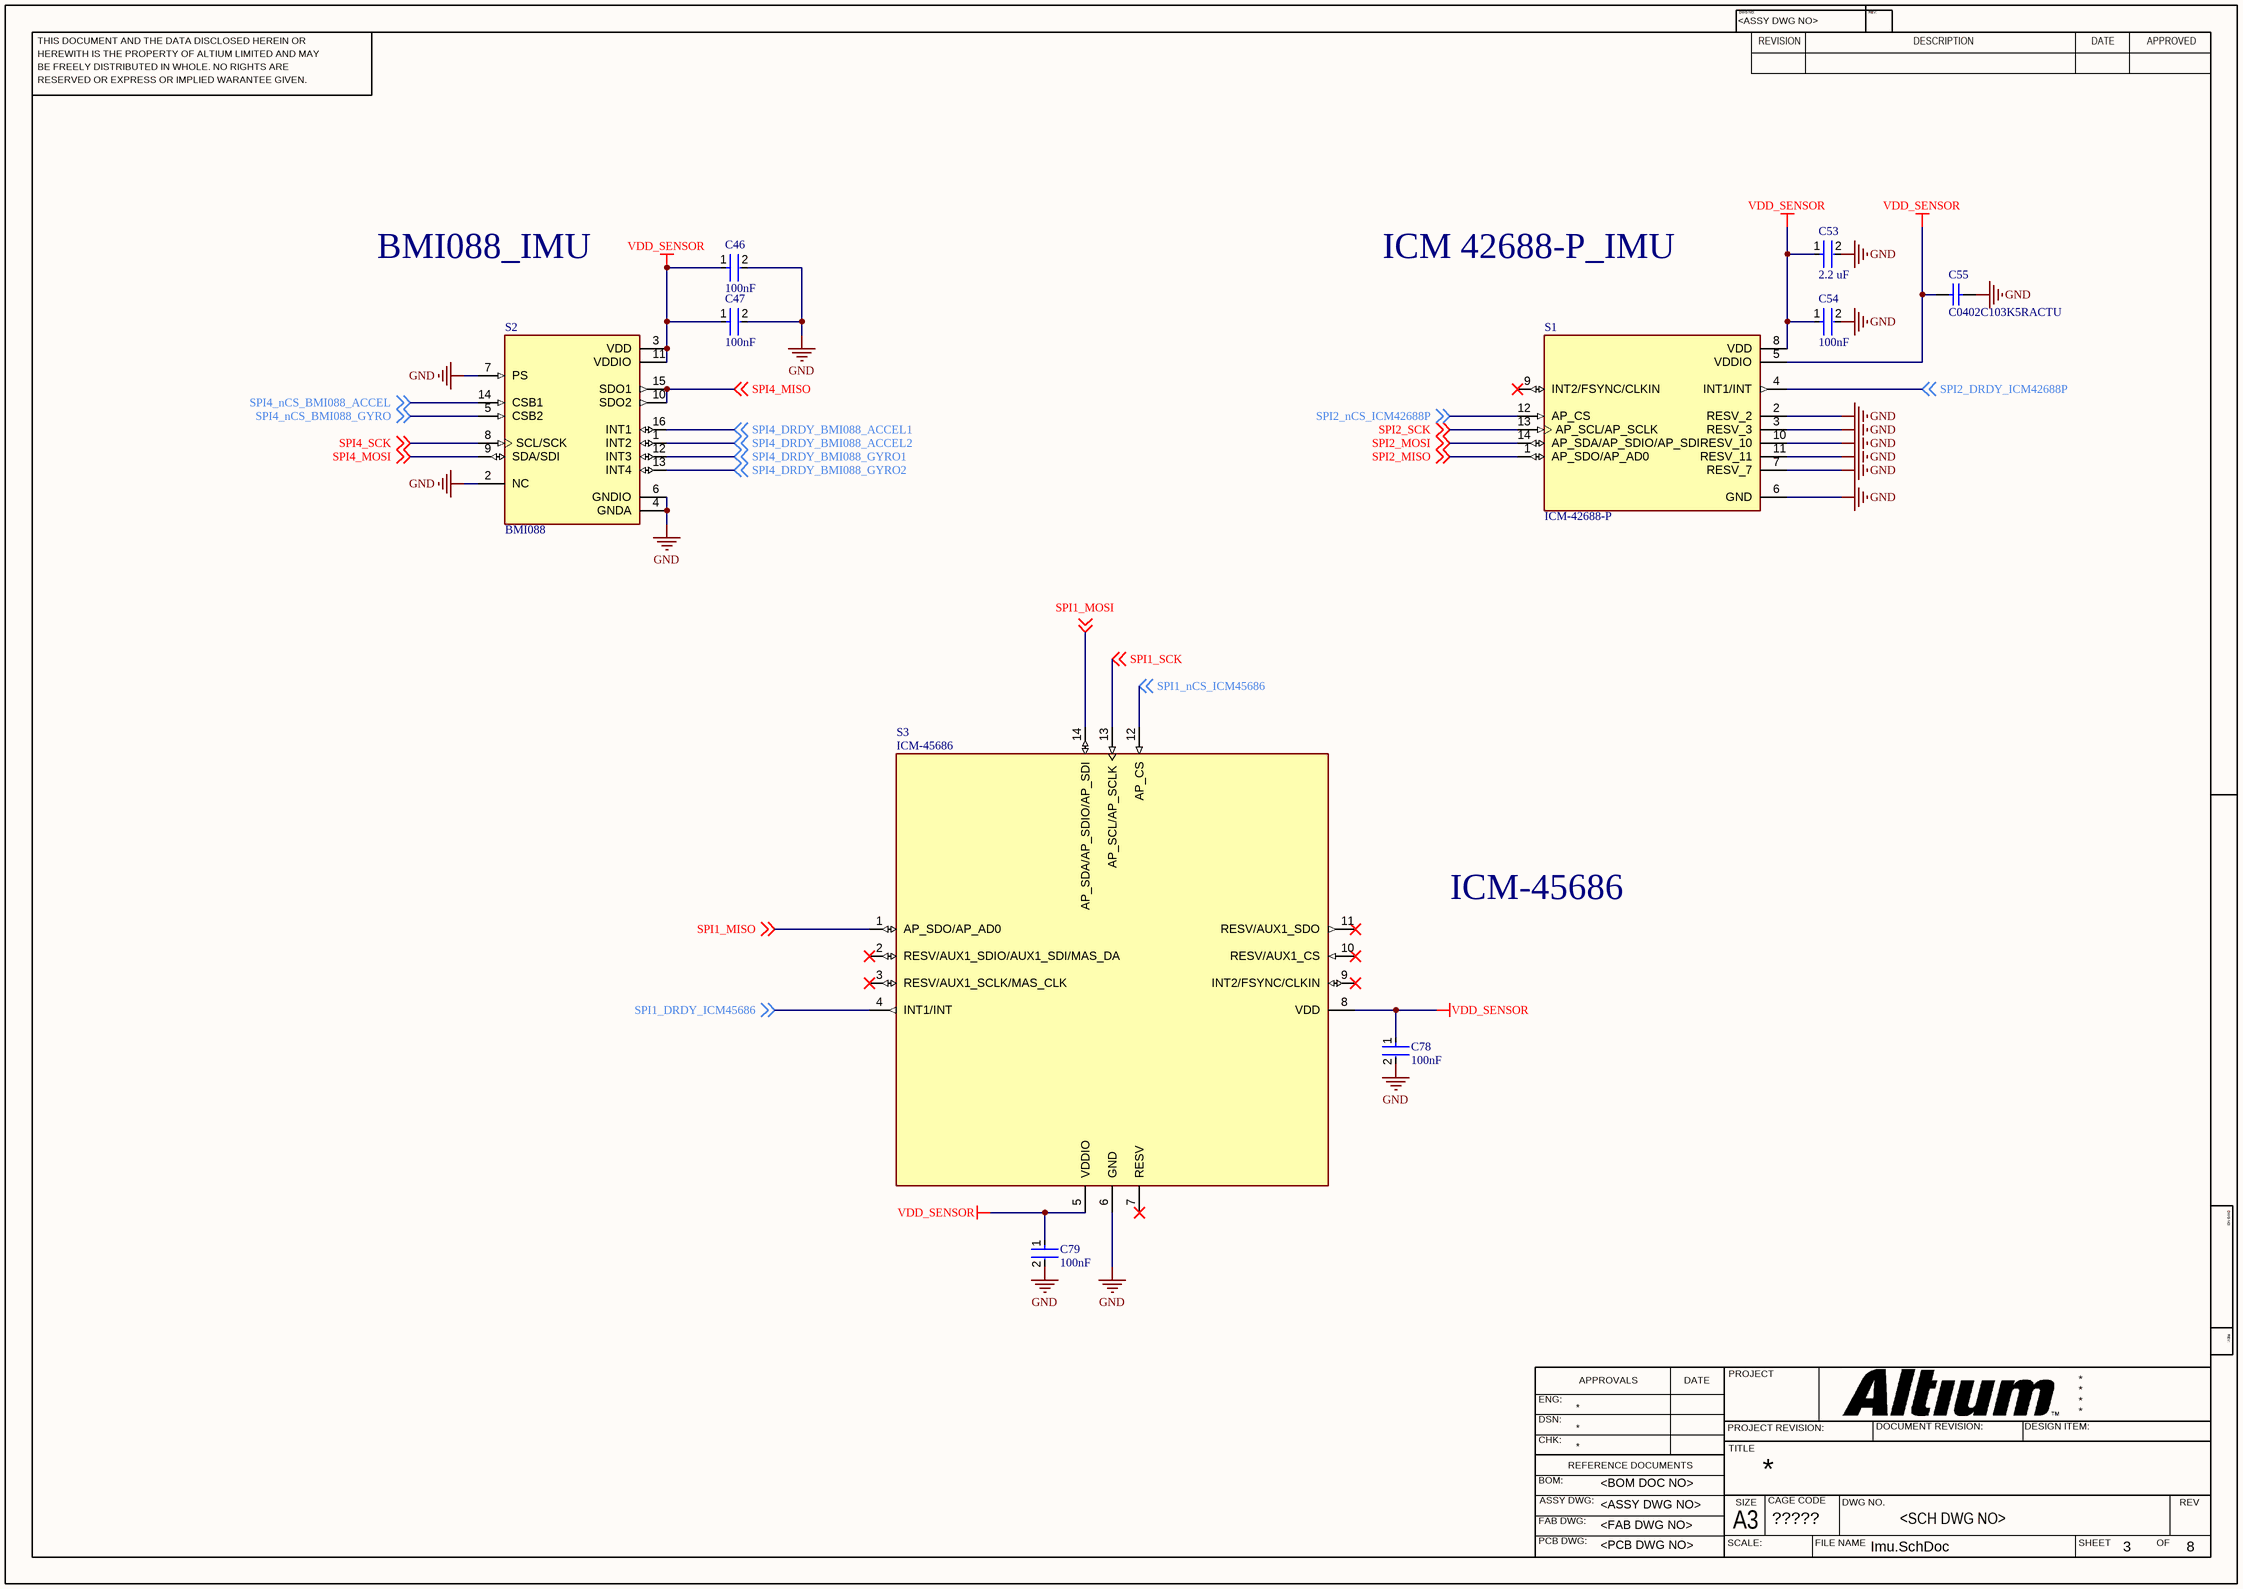
[diagram p2: Imu.SchDoc]

### Parts
C46  100nF  [FP-CC0402-MFG]
C47  100nF  [FP-CC0402-MFG]
C53  2.2 uF  [FP-C1005-050-IPC_A]
C54  100nF  [FP-CC0402-MFG]
C55  C0402C103K5RACTU  [CAPC1005X55X30LL05T10]
C78  100nF  [FP-CC0402-MFG]
C79  100nF  [FP-CC0402-MFG]
S1  ICM-42688-P  [PQFN50P300X250X97-14N]
S2  BMI088  [PQFN50P450X300X100-16N]
S3  ICM-45686  [IC_ICM-45686]

### Nets
GND: C46.2 C47.2 C53.2 C54.2 C55.2 C78.2 C79.2 S1.2(RESV_2) S1.3(RESV_3) S1.6(GND) S1.7(RESV_7) S1.10(RESV_10) S1.11(RESV_11) S2.2(NC) S2.4(GNDA) S2.6(GNDIO) S2.7(PS) S3.6(GND)
VDD_SENSOR: C46.1 C47.1 C53.1 C54.1 C55.1 C78.1 C79.1 S1.5(VDDIO) S1.8(VDD) S2.3(VDD) S2.11(VDDIO) S3.5(VDDIO) S3.8(VDD)
SPI1_DRDY_ICM45686: S3.4(INT1/INT) ; off-sheet SPI1_DRDY_ICM45686
SPI1_MISO: S3.1(AP_SDO/AP_AD0) ; off-sheet SPI1_MISO
SPI1_MOSI: S3.14(AP_SDA/AP_SDIO/AP_SDI) ; off-sheet SPI1_MOSI
SPI1_nCS_ICM45686: S3.12(AP_CS) ; off-sheet SPI1_nCS_ICM45686
SPI1_SCK: S3.13(AP_SCL/AP_SCLK) ; off-sheet SPI1_SCK
SPI2_DRDY_ICM42688P: S1.4(INT1/INT) ; off-sheet SPI2_DRDY_ICM42688P
SPI2_MISO: S1.1(AP_SDO/AP_AD0) ; off-sheet SPI2_MISO
SPI2_MOSI: S1.14(AP_SDA/AP_SDIO/AP_SDI) ; off-sheet SPI2_MOSI
SPI2_nCS_ICM42688P: S1.12(AP_CS) ; off-sheet SPI2_nCS_ICM42688P
SPI2_SCK: S1.13(AP_SCL/AP_SCLK) ; off-sheet SPI2_SCK
SPI4_DRDY_BMI088_ACCEL1: S2.16(INT1) ; off-sheet SPI4_DRDY_BMI088_ACCEL1
SPI4_DRDY_BMI088_ACCEL2: S2.1(INT2) ; off-sheet SPI4_DRDY_BMI088_ACCEL2
SPI4_DRDY_BMI088_GYRO1: S2.12(INT3) ; off-sheet SPI4_DRDY_BMI088_GYRO1
SPI4_DRDY_BMI088_GYRO2: S2.13(INT4) ; off-sheet SPI4_DRDY_BMI088_GYRO2
SPI4_MISO: S2.10(SDO2) S2.15(SDO1) ; off-sheet SPI4_MISO
SPI4_MOSI: S2.9(SDA/SDI) ; off-sheet SPI4_MOSI
SPI4_nCS_BMI088_ACCEL: S2.14(CSB1) ; off-sheet SPI4_nCS_BMI088_ACCEL
SPI4_nCS_BMI088_GYRO: S2.5(CSB2) ; off-sheet SPI4_nCS_BMI088_GYRO
SPI4_SCK: S2.8(SCL/SCK) ; off-sheet SPI4_SCK

Not connected (* = marked no-connect by the designer): S1 9(INT2/FSYNC/CLKIN)*; S3 2(RESV/AUX1_SDIO/AUX1_SDI/MAS_DA)* 3(RESV/AUX1_SCLK/MAS_CLK)* 7(RESV)* 9(INT2/FSYNC/CLKIN)* 10(RESV/AUX1_CS)* 11(RESV/AUX1_SDO)*

### Notes on the sheet
- BMI088_IMU
- ICM 42688-P_IMU
- ICM-45686
- THIS DOCUMENT AND THE DATA DISCLOSED HEREIN OR
- HEREWITH IS THE PROPERTY OF ALTIUM LIMITED AND MAY
- DWG NO:
- REVISION
- REV:
- DESCRIPTION
- DATE
- APPROVED
- BE FREELY DISTRIBUTED IN WHOLE. NO RIGHTS ARE
- RESERVED OR EXPRESS OR IMPLIED WARANTEE GIVEN.
- ENG:
- APPROVALS
- PROJECT
- DSN:
- CHK:
- REFERENCE DOCUMENTS
- PROJECT REVISION:
- TITLE
- DOCUMENT REVISION:
- DESIGN ITEM:
- BOM:
- FAB DWG:
- PCB DWG:
- ASSY DWG:
- SCALE:
- A3
- SIZE
- CAGE CODE
- FILE NAME
- DWG NO.
- SHEET
- OF
- REV

### Library data of the parts
C46 C47 C54 C78 C79 = CMP-03422-001121-1: as C3 on sheet MCU; Digikey Description: CAP CER 0.1UF 16V X7R 0402; Temperature Range Low: -55°C; Footprint Url: http://www.yageo.com/exep/pages/download/literatures/UPY-C_GEN_24.pdf; RoHS: TRUE; Device Class L3: Ceramic Capacitors; Temperature Characteristic: X7R; Capacitance: 100 nF; Package: CC0402; Device Class L1: Passive Components; Lead Free: Yes; Temperature Range High: +125°C; Category: Cap; Mouser Description: 0402 0.1 uF 16 V ±10% Tolerance X7R SMT Multilayer Ceramic Capacitor; Voltage Rating: 16 V; Value: 100 nF; ComponentLink2Description: Datasheet; Automotive: No; Octopart: https://octopart.com/cc0402kpx7r7bb104-yageo-21548559; ComponentLink2URL: http://www.yageo.com/documents/recent/UPY-GP_NP0_16V-to-50V_16.pdf; Height: 0.55mm; Device Class L2: Capacitors; Temperature: -55°C to +125°C; Ipc Land Pattern Name: CAPC10050X50
C53 = CMP-08246-004339-1: CAP CER 2.2UF 25V X5R 0402; Dielectric Material: Ceramic; Tolerance: 10%; REACH SVHC: No SVHC; Weight: 2.3E-05oz; Capacitance: 2.2uF; Length: 1mm; RoHS Compliant: Yes; Package Quantity: 1; Voltage Rating (DC): 25V; Dielectric: X5R; Series: C; Voltage Rating: 25V; Case Code (Imperial): 0402; Min Operating Temperature: -55°C; Depth: 0.5mm; Resistor Type: Ceramic; Height: 0.5mm; Width: 0.5mm; Mount: Surface Mount; Case Code (Metric): 1005; Case/Package: 0402; Max Operating Temperature: 85°C; Thickness: 0.022inch; Lead Free: Lead Free; Termination: SMD/SMT; Packaging: Tape and Reel
C55 = CMP-1034-01886-2: Manufacturer: Kemet; Part Number: C0402C103K5RACTU
S1 = CMP-010-00026-1: Accelerometer, Gyroscope, 6 Axis Sensor Output; MP: ICM-42688-P; Source: ICM-42688-P.SchLib; Pins: 14; Availability: Unavailable; Price: None; Value: *; Component Type: Standard; Design Item ID: ICM-42688-P; Case/Package: None
S2 = CMP-010-00024-1: High-performance 6-axis inertial sensor (accelerometer + gyroscope) <a href="https://pricing.snapeda.com/parts/BMI088/Bosch%20Sensortec/view-part?ref=eda">Check prices</a>; Design Item ID: BMI088; Source: BMI088.SchLib; Case/Package: None; Value: *; Availability: Unavailable; Component Type: Standard; Pins: 16; Price: None; MP: BMI088
S3 = CMP-010-00025-1: Accelerometer, Gyroscope, 6 Axis Sensor I2C, I3C, SPI Output; MF: TDK InvenSense; Design Item ID: ICM-45686; Component Type: Standard; Check_prices: https://www.snapeda.com/parts/ICM-45686/TDK+InvenSense/view-part/?ref=eda; Case/Package: Package; SnapEDA_Link: https://www.snapeda.com/parts/ICM-45686/TDK+InvenSense/view-part/?ref=snap; Pins: 14; Source: ICM-45686.SchLib; MP: ICM-45686; Value: *

## Sheet Barometer.SchDoc
size 420 x 297 mm; SheetNumber: 4; SheetTotal: 8
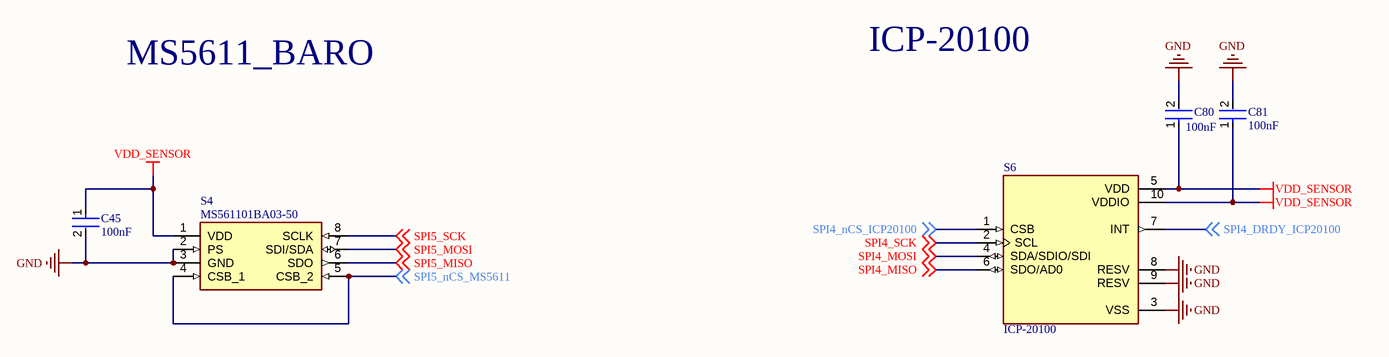
[diagram p3: Barometer.SchDoc]

### Parts
C45  100nF  [FP-CC0402-MFG]
C80  100nF  [FP-CC0402-MFG]
C81  100nF  [FP-CC0402-MFG]
S4  MS561101BA03-50  [MS561101BA03-50]
S6  ICP-20100  [PQFN50P200X200X85-10N]

### Nets
GND: C45.2 C80.2 C81.2 S4.2(PS) S4.3(GND) S6.3(VSS) S6.8(RESV) S6.9(RESV)
VDD_SENSOR: C45.1 C80.1 C81.1 S4.1(VDD) S6.5(VDD) S6.10(VDDIO)
SPI4_DRDY_ICP20100: S6.7(INT) ; off-sheet SPI4_DRDY_ICP20100
SPI4_MISO: S6.6(SDO/AD0) ; off-sheet SPI4_MISO
SPI4_MOSI: S6.4(SDA/SDIO/SDI) ; off-sheet SPI4_MOSI
SPI4_nCS_ICP20100: S6.1(CSB) ; off-sheet SPI4_nCS_ICP20100
SPI4_SCK: S6.2(SCL) ; off-sheet SPI4_SCK
SPI5_MISO: S4.6(SDO) ; off-sheet SPI5_MISO
SPI5_MOSI: S4.7(SDI/SDA) ; off-sheet SPI5_MOSI
SPI5_nCS_MS5611: S4.4(CSB_1) S4.5(CSB_2) ; off-sheet SPI5_nCS_MS5611
SPI5_SCK: S4.8(SCLK) ; off-sheet SPI5_SCK

### Notes on the sheet
- MS5611_BARO
- ICP-20100
- THIS DOCUMENT AND THE DATA DISCLOSED HEREIN OR
- HEREWITH IS THE PROPERTY OF ALTIUM LIMITED AND MAY
- DWG NO:
- REVISION
- REV:
- DESCRIPTION
- DATE
- APPROVED
- BE FREELY DISTRIBUTED IN WHOLE. NO RIGHTS ARE
- RESERVED OR EXPRESS OR IMPLIED WARANTEE GIVEN.
- ENG:
- APPROVALS
- PROJECT
- DSN:
- CHK:
- REFERENCE DOCUMENTS
- PROJECT REVISION:
- TITLE
- DOCUMENT REVISION:
- DESIGN ITEM:
- BOM:
- FAB DWG:
- PCB DWG:
- ASSY DWG:
- SCALE:
- A3
- SIZE
- CAGE CODE
- FILE NAME
- DWG NO.
- SHEET
- OF
- REV

### Library data of the parts
C45 C80 C81 = CMP-03422-001121-1: as C3 on sheet MCU; Digikey Description: CAP CER 0.1UF 16V X7R 0402; Temperature Range Low: -55°C; Footprint Url: http://www.yageo.com/exep/pages/download/literatures/UPY-C_GEN_24.pdf; RoHS: TRUE; Device Class L3: Ceramic Capacitors; Temperature Characteristic: X7R; Capacitance: 100 nF; Package: CC0402; Device Class L1: Passive Components; Lead Free: Yes; Temperature Range High: +125°C; Category: Cap; Mouser Description: 0402 0.1 uF 16 V ±10% Tolerance X7R SMT Multilayer Ceramic Capacitor; Voltage Rating: 16 V; Value: 100 nF; ComponentLink2Description: Datasheet; Automotive: No; Octopart: https://octopart.com/cc0402kpx7r7bb104-yageo-21548559; ComponentLink2URL: http://www.yageo.com/documents/recent/UPY-GP_NP0_16V-to-50V_16.pdf; Height: 0.55mm; Device Class L2: Capacitors; Temperature: -55°C to +125°C; Ipc Land Pattern Name: CAPC10050X50
S4 = MS561101BA03-50: Integrated Circuit; Manufacturer_Name: TE Connectivity; Datasheet Link: https://www.te.com/commerce/DocumentDelivery/DDEController?Action=srchrtrv&DocNm=MS5611-01BA03&DocType=Data%20Sheet&DocLang=English&PartCntxt=MS561101BA03-50&DocFormat=pdf; Manufacturer_Part_Number: MS561101BA03-50; Mouser Part Number: 824-MS561101BA03-50; Mouser Price/Stock: https://www.mouser.co.uk/ProductDetail/Measurement-Specialties/MS561101BA03-50?qs=%252BgKeJhng5iV%252BnCz6Qd5iDw%3D%3D; Arrow Part Number: MS561101BA03-50; Arrow Price/Stock: https://www.arrow.com/en/products/ms561101ba03-50/te-connectivity?region=nac
S6 = CMP-010-00027-1: MF: TDK InvenSense; Availability: Not in stock; SnapEDA_Link: https://www.snapeda.com/parts/ICP-20100/TDK%20InvenSense/view-part/7331147/?ref=snap; Check_prices: https://www.snapeda.com/parts/ICP-20100/TDK%20InvenSense/view-part/7331147/?ref=eda; Source: ICP-20100.SchLib; Pins: 10; Value: *; Component Type: Standard; Case/Package: None; Design Item ID: ICP-20100; Price: None; MP: ICP-20100

## Sheet Pwm.SchDoc
size 420 x 297 mm; SheetNumber: 5; SheetTotal: 8
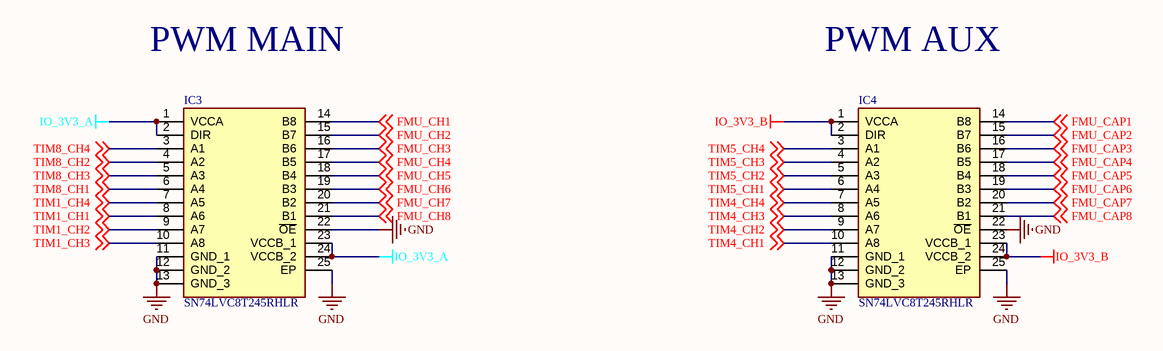
[diagram p4: Pwm.SchDoc]

### Parts
IC3  SN74LVC8T245RHLR  [RHL_(R-PVQFN-N24)]
IC4  SN74LVC8T245RHLR  [RHL_(R-PVQFN-N24)]

### Nets
GND: IC3.11(GND_1) IC3.12(GND_2) IC3.13(GND_3) IC3.22(~{OE}) IC3.25(EP) IC4.11(GND_1) IC4.12(GND_2) IC4.13(GND_3) IC4.22(~{OE}) IC4.25(EP)
IO_3V3_A: IC3.1(VCCA) IC3.2(DIR) IC3.23(VCCB_1) IC3.24(VCCB_2)
IO_3V3_B: IC4.1(VCCA) IC4.2(DIR) IC4.23(VCCB_1) IC4.24(VCCB_2)
FMU_CAP1: IC4.14(B8) ; off-sheet FMU_CAP1
FMU_CAP2: IC4.15(B7) ; off-sheet FMU_CAP2
FMU_CAP3: IC4.16(B6) ; off-sheet FMU_CAP3
FMU_CAP4: IC4.17(B5) ; off-sheet FMU_CAP4
FMU_CAP5: IC4.18(B4) ; off-sheet FMU_CAP5
FMU_CAP6: IC4.19(B3) ; off-sheet FMU_CAP6
FMU_CAP7: IC4.20(B2) ; off-sheet FMU_CAP7
FMU_CAP8: IC4.21(B1) ; off-sheet FMU_CAP8
FMU_CH1: IC3.14(B8) ; off-sheet FMU_CH1
FMU_CH2: IC3.15(B7) ; off-sheet FMU_CH2
FMU_CH3: IC3.16(B6) ; off-sheet FMU_CH3
FMU_CH4: IC3.17(B5) ; off-sheet FMU_CH4
FMU_CH5: IC3.18(B4) ; off-sheet FMU_CH5
FMU_CH6: IC3.19(B3) ; off-sheet FMU_CH6
FMU_CH7: IC3.20(B2) ; off-sheet FMU_CH7
FMU_CH8: IC3.21(B1) ; off-sheet FMU_CH8
TIM1_CH1: IC3.8(A6) ; off-sheet TIM1_CH1
TIM1_CH2: IC3.9(A7) ; off-sheet TIM1_CH2
TIM1_CH3: IC3.10(A8) ; off-sheet TIM1_CH3
TIM1_CH4: IC3.7(A5) ; off-sheet TIM1_CH4
TIM4_CH1: IC4.10(A8) ; off-sheet TIM4_CH1
TIM4_CH2: IC4.9(A7) ; off-sheet TIM4_CH2
TIM4_CH3: IC4.8(A6) ; off-sheet TIM4_CH3
TIM4_CH4: IC4.7(A5) ; off-sheet TIM4_CH4
TIM5_CH1: IC4.6(A4) ; off-sheet TIM5_CH1
TIM5_CH2: IC4.5(A3) ; off-sheet TIM5_CH2
TIM5_CH3: IC4.4(A2) ; off-sheet TIM5_CH3
TIM5_CH4: IC4.3(A1) ; off-sheet TIM5_CH4
TIM8_CH1: IC3.6(A4) ; off-sheet TIM8_CH1
TIM8_CH2: IC3.4(A2) ; off-sheet TIM8_CH2
TIM8_CH3: IC3.5(A3) ; off-sheet TIM8_CH3
TIM8_CH4: IC3.3(A1) ; off-sheet TIM8_CH4

### Notes on the sheet
- PWM MAIN
- PWM AUX
- THIS DOCUMENT AND THE DATA DISCLOSED HEREIN OR
- HEREWITH IS THE PROPERTY OF ALTIUM LIMITED AND MAY
- DWG NO:
- REVISION
- REV:
- DESCRIPTION
- DATE
- APPROVED
- BE FREELY DISTRIBUTED IN WHOLE. NO RIGHTS ARE
- RESERVED OR EXPRESS OR IMPLIED WARANTEE GIVEN.
- ENG:
- APPROVALS
- PROJECT
- DSN:
- CHK:
- REFERENCE DOCUMENTS
- PROJECT REVISION:
- TITLE
- DOCUMENT REVISION:
- DESIGN ITEM:
- BOM:
- FAB DWG:
- PCB DWG:
- ASSY DWG:
- SCALE:
- A3
- SIZE
- CAGE CODE
- FILE NAME
- DWG NO.
- SHEET
- OF
- REV

### Library data of the parts
IC3 IC4 = SN74LVC8T245RHLR: Integrated Circuit; Manufacturer_Name: Texas Instruments; Datasheet Link: http://www.ti.com/lit/gpn/sn74lvc8t245; Manufacturer_Part_Number: SN74LVC8T245RHLR; Mouser Part Number: 595-SN74LVC8T245RHLR; Mouser Price/Stock: https://www.mouser.co.uk/ProductDetail/Texas-Instruments/SN74LVC8T245RHLR?qs=dT9u2OTAaVWMeuErzytHQg%3D%3D; Arrow Part Number: SN74LVC8T245RHLR; Arrow Price/Stock: https://www.arrow.com/en/products/sn74lvc8t245rhlr/texas-instruments?region=nac

## Sheet Uart.SchDoc
size 420 x 297 mm; SheetNumber: 6; SheetTotal: 8
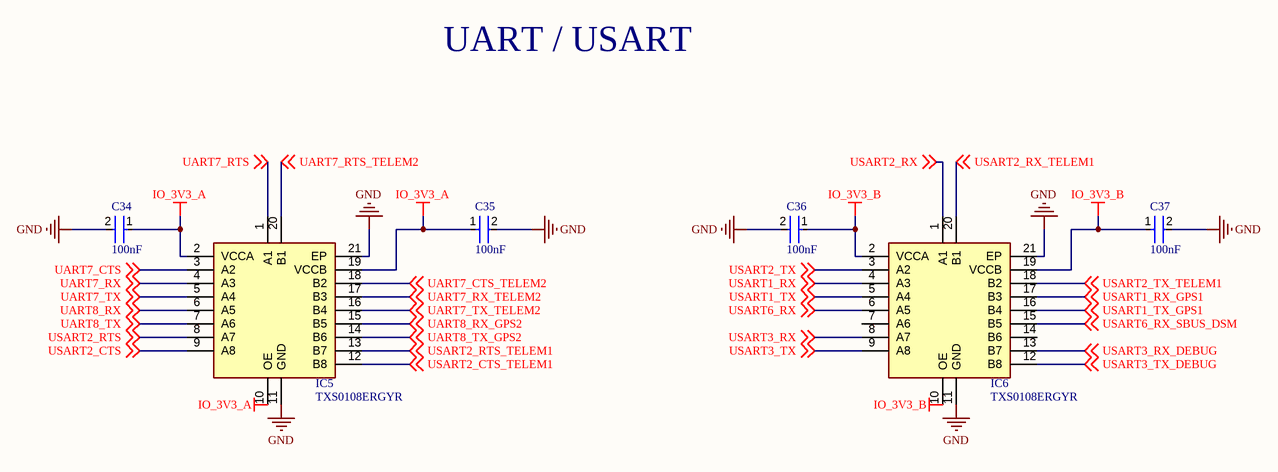
[diagram p5: Uart.SchDoc]

### Parts
C34  100nF  [FP-CC0402-MFG]
C35  100nF  [FP-CC0402-MFG]
C36  100nF  [FP-CC0402-MFG]
C37  100nF  [FP-CC0402-MFG]
IC5  TXS0108ERGYR  [SN74LVC541ARGYR]
IC6  TXS0108ERGYR  [SN74LVC541ARGYR]

### Nets
GND: C34.2 C35.2 C36.2 C37.2 IC5.11(GND) IC5.21(EP) IC6.11(GND) IC6.21(EP)
IO_3V3_A: C34.1 C35.1 IC5.2(VCCA) IC5.10(OE) IC5.19(VCCB)
IO_3V3_B: C36.1 C37.1 IC6.2(VCCA) IC6.10(OE) IC6.19(VCCB)
UART7_CTS: IC5.3(A2) ; off-sheet UART7_CTS
UART7_CTS_TELEM2: IC5.18(B2) ; off-sheet UART7_CTS_TELEM2
UART7_RTS: IC5.1(A1) ; off-sheet UART7_RTS
UART7_RTS_TELEM2: IC5.20(B1) ; off-sheet UART7_RTS_TELEM2
UART7_RX: IC5.4(A3) ; off-sheet UART7_RX
UART7_RX_TELEM2: IC5.17(B3) ; off-sheet UART7_RX_TELEM2
UART7_TX: IC5.5(A4) ; off-sheet UART7_TX
UART7_TX_TELEM2: IC5.16(B4) ; off-sheet UART7_TX_TELEM2
UART8_RX: IC5.6(A5) ; off-sheet UART8_RX
UART8_RX_GPS2: IC5.15(B5) ; off-sheet UART8_RX_GPS2
UART8_TX: IC5.7(A6) ; off-sheet UART8_TX
UART8_TX_GPS2: IC5.14(B6) ; off-sheet UART8_TX_GPS2
USART1_RX: IC6.4(A3) ; off-sheet USART1_RX
USART1_RX_GPS1: IC6.17(B3) ; off-sheet USART1_RX_GPS1
USART1_TX: IC6.5(A4) ; off-sheet USART1_TX
USART1_TX_GPS1: IC6.16(B4) ; off-sheet USART1_TX_GPS1
USART2_CTS: IC5.9(A8) ; off-sheet USART2_CTS
USART2_CTS_TELEM1: IC5.12(B8) ; off-sheet USART2_CTS_TELEM1
USART2_RTS: IC5.8(A7) ; off-sheet USART2_RTS
USART2_RTS_TELEM1: IC5.13(B7) ; off-sheet USART2_RTS_TELEM1
USART2_RX: IC6.1(A1) ; off-sheet USART2_RX
USART2_RX_TELEM1: IC6.20(B1) ; off-sheet USART2_RX_TELEM1
USART2_TX: IC6.3(A2) ; off-sheet USART2_TX
USART2_TX_TELEM1: IC6.18(B2) ; off-sheet USART2_TX_TELEM1
USART3_RX: IC6.8(A7) ; off-sheet USART3_RX
USART3_RX_DEBUG: IC6.13(B7) ; off-sheet USART3_RX_DEBUG
USART3_TX: IC6.9(A8) ; off-sheet USART3_TX
USART3_TX_DEBUG: IC6.12(B8) ; off-sheet USART3_TX_DEBUG
USART6_RX: IC6.6(A5) ; off-sheet USART6_RX
USART6_RX_SBUS_DSM: IC6.15(B5) ; off-sheet USART6_RX_SBUS_DSM

Not connected (* = marked no-connect by the designer): IC6 7(A6) 14(B6)

### Notes on the sheet
- UART / USART
- THIS DOCUMENT AND THE DATA DISCLOSED HEREIN OR
- HEREWITH IS THE PROPERTY OF ALTIUM LIMITED AND MAY
- DWG NO:
- REVISION
- REV:
- DESCRIPTION
- DATE
- APPROVED
- BE FREELY DISTRIBUTED IN WHOLE. NO RIGHTS ARE
- RESERVED OR EXPRESS OR IMPLIED WARANTEE GIVEN.
- ENG:
- APPROVALS
- PROJECT
- DSN:
- CHK:
- REFERENCE DOCUMENTS
- PROJECT REVISION:
- TITLE
- DOCUMENT REVISION:
- DESIGN ITEM:
- BOM:
- FAB DWG:
- PCB DWG:
- ASSY DWG:
- SCALE:
- A3
- SIZE
- CAGE CODE
- FILE NAME
- DWG NO.
- SHEET
- OF
- REV

### Library data of the parts
C34-C37 = CMP-03422-001121-1: as C3 on sheet MCU; Digikey Description: CAP CER 0.1UF 16V X7R 0402; Temperature Range Low: -55°C; Footprint Url: http://www.yageo.com/exep/pages/download/literatures/UPY-C_GEN_24.pdf; RoHS: TRUE; Device Class L3: Ceramic Capacitors; Temperature Characteristic: X7R; Capacitance: 100 nF; Package: CC0402; Device Class L1: Passive Components; Lead Free: Yes; Temperature Range High: +125°C; Category: Cap; Mouser Description: 0402 0.1 uF 16 V ±10% Tolerance X7R SMT Multilayer Ceramic Capacitor; Voltage Rating: 16 V; Value: 100 nF; ComponentLink2Description: Datasheet; Automotive: No; Octopart: https://octopart.com/cc0402kpx7r7bb104-yageo-21548559; ComponentLink2URL: http://www.yageo.com/documents/recent/UPY-GP_NP0_16V-to-50V_16.pdf; Height: 0.55mm; Device Class L2: Capacitors; Temperature: -55°C to +125°C; Ipc Land Pattern Name: CAPC10050X50
IC5 IC6 = TXS0108ERGYR: Integrated Circuit; Manufacturer_Name: Texas Instruments; Datasheet Link: http://www.ti.com/lit/gpn/txs0108e; Height: 1mm; Manufacturer_Part_Number: TXS0108ERGYR; Mouser Part Number: 595-TXS0108ERGYR; Mouser Price/Stock: https://www.mouser.co.uk/ProductDetail/Texas-Instruments/TXS0108ERGYR?qs=dqESbKqT1jau1kZv8JPj9Q%3D%3D; Arrow Part Number: TXS0108ERGYR; Arrow Price/Stock: https://www.arrow.com/en/products/txs0108ergyr/texas-instruments?utm_currency=USD&region=nac

## Sheet Can.SchDoc
size 420 x 297 mm; SheetNumber: 7; SheetTotal: 8
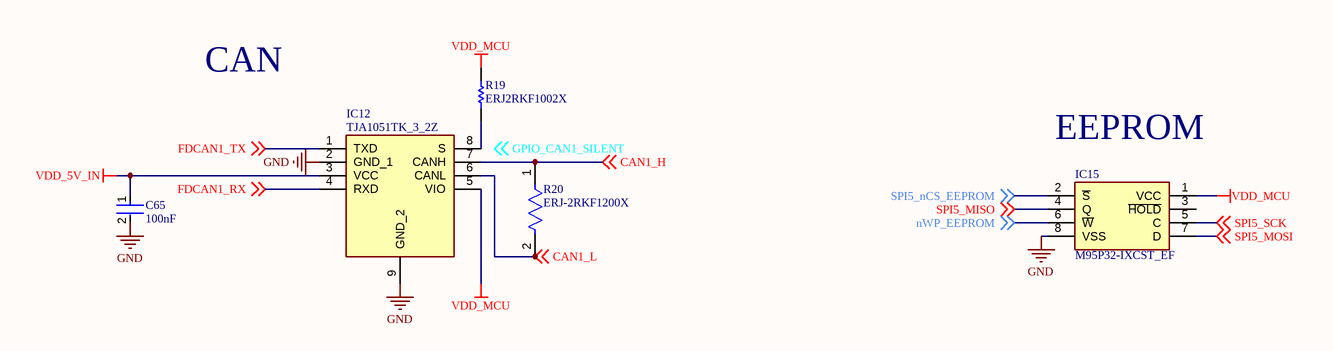
[diagram p6: Can.SchDoc]

### Parts
C65  100nF  [FP-CC0402-MFG]
IC12  TJA1051TK_3_2Z  [SON65P300X300X100-9N-D]
IC15  M95P32-IXCST_EF  [M95P32IXCSTEF]
R19  ERJ2RKF1002X  [RESC1005X40X25LL05T05]
R20  ERJ-2RKF1200X  [FP-ERJ2RK-MFG]

### Nets
GND: C65.2 IC12.2(GND_1) IC12.9(GND_2) IC15.8(VSS)
VDD_5V_IN: C65.1 IC12.3(VCC)
VDD_MCU: IC12.5(VIO) IC15.1(VCC) R19.2
CAN1_H: IC12.7(CANH) R20.1 ; off-sheet CAN1_H
CAN1_L: IC12.6(CANL) R20.2 ; off-sheet CAN1_L
FDCAN1_RX: IC12.4(RXD) ; off-sheet FDCAN1_RX
FDCAN1_TX: IC12.1(TXD) ; off-sheet FDCAN1_TX
nWP_EEPROM: IC15.6(~{W}) ; off-sheet nWP_EEPROM
SPI5_MISO: IC15.4(Q) ; off-sheet SPI5_MISO
SPI5_MOSI: IC15.7(D) ; off-sheet SPI5_MOSI
SPI5_nCS_EEPROM: IC15.2(~{S}) ; off-sheet SPI5_nCS_EEPROM
SPI5_SCK: IC15.5(C) ; off-sheet SPI5_SCK
NetIC12_8: IC12.8(S) R19.1

Not connected (* = marked no-connect by the designer): IC15 3(~{HOLD})

### Notes on the sheet
- CAN
- (near IC15) EEPROM
- Labels drawn without touching a wire or pin: GPIO_CAN1_SILENT
- THIS DOCUMENT AND THE DATA DISCLOSED HEREIN OR
- HEREWITH IS THE PROPERTY OF ALTIUM LIMITED AND MAY
- DWG NO:
- REVISION
- REV:
- DESCRIPTION
- DATE
- APPROVED
- BE FREELY DISTRIBUTED IN WHOLE. NO RIGHTS ARE
- RESERVED OR EXPRESS OR IMPLIED WARANTEE GIVEN.
- ENG:
- APPROVALS
- PROJECT
- DSN:
- CHK:
- REFERENCE DOCUMENTS
- PROJECT REVISION:
- TITLE
- DOCUMENT REVISION:
- DESIGN ITEM:
- BOM:
- FAB DWG:
- PCB DWG:
- ASSY DWG:
- SCALE:
- A3
- SIZE
- CAGE CODE
- FILE NAME
- DWG NO.
- SHEET
- OF
- REV

### Library data of the parts
C65 = CMP-03422-001121-1: as C3 on sheet MCU; Digikey Description: CAP CER 0.1UF 16V X7R 0402; Temperature Range Low: -55°C; Footprint Url: http://www.yageo.com/exep/pages/download/literatures/UPY-C_GEN_24.pdf; RoHS: TRUE; Device Class L3: Ceramic Capacitors; Temperature Characteristic: X7R; Capacitance: 100 nF; Package: CC0402; Device Class L1: Passive Components; Lead Free: Yes; Temperature Range High: +125°C; Category: Cap; Mouser Description: 0402 0.1 uF 16 V ±10% Tolerance X7R SMT Multilayer Ceramic Capacitor; Voltage Rating: 16 V; Value: 100 nF; ComponentLink2Description: Datasheet; Automotive: No; Octopart: https://octopart.com/cc0402kpx7r7bb104-yageo-21548559; ComponentLink2URL: http://www.yageo.com/documents/recent/UPY-GP_NP0_16V-to-50V_16.pdf; Height: 0.55mm; Device Class L2: Capacitors; Temperature: -55°C to +125°C; Ipc Land Pattern Name: CAPC10050X50
IC12 = TJA1051TK_3: Integrated Circuit; Manufacturer_Name: NXP; Manufacturer_Part_Number: TJA1051TK/3; Datasheet Link: https://www.nxp.com/docs/en/data-sheet/TJA1051.pdf; Height: 1mm; Mouser Part Number: N/A; Mouser Price/Stock: https://www.mouser.co.uk/ProductDetail/NXP-Semiconductors/TJA1051TK-3?qs=fAHHVMwC%252BbjHKozSeK7tBA%3D%3D
IC15 = M95P32-IXCST_EF: Integrated Circuit; Manufacturer_Name: STMicroelectronics; Manufacturer_Part_Number: M95P32-IXCST/EF; Datasheet Link: https://www.st.com/resource/en/datasheet/m95p32-i.pdf; Height: 0.58mm; Mouser Part Number: 511-M95P32-IXCST/EF; Mouser Price/Stock: https://www.mouser.co.uk/ProductDetail/STMicroelectronics/M95P32-IXCST-EF?qs=rQFj71Wb1eVk689cPUP7pg%3D%3D; Arrow Part Number: M95P32-IXCST/EF; Arrow Price/Stock: https://www.arrow.com/en/products/m95p32-ixcstef/stmicroelectronics?utm_currency=USD&region=nac
R19 = CMP-2000-07588-1: as R5 on sheet MCU; RoHSCompliant: True; Lead Free: LeadFree; Package Quantity: 1; Contact Plating: Tin; Length: 1mm; Radiation Hardening: No; REACH SVHC: NoSVHC; Max Operating Temperature: 155degC; Depth: 0.5mm; Case Code (Imperial): 0402; Military Standard: Not; Package Description: 2-Pin Surface Mount Device, Body 1 x 0.5 mm; Termination: SMD/SMT; Case Code (Metric): 1005; Height: 0.35mm; Packaging: TapeandReel; Voltage Rating (DC): 50V; Package Reference: 402; Number of Pins: 2; Tolerance: 1%; Mounting Technology: SurfaceMount; Width: 0.02inch; Mount: SurfaceMount; Datasheet URL: https://industrial.panasonic.com/cdbs/www-data/pdf/RDA0000/AOA0000C304.pdf; Composition: ThickFilm; Datasheet Version: 02/2017; Manufacturer URL: http://www.panasonic.com/; Max Power Dissipation: 100mW; Number of Terminations: 2; Min Operating Temperature: -55degC
R20 = CMP-2002-00645-2: RES SMD 120 OHM 1% 1/10W 0402; Resistance: 120R; Voltage Rating (DC): 50V; Temperature Coefficient: 100ppm/°C; Power Rating: 100mW; Case Code (Imperial): 0402; Military Standard: Not; Width: 0.5mm; Technology: THICK FILM; Case Code (Metric): 1005; Lead Free: Lead Free; Radiation Hardening: No; Termination: SMD/SMT; Weight: 0.000388oz; Case/Package: 0402; Resistor Type: Thick Film; Number of Pins: 2; Package Quantity: 10000; Tolerance: 1%; Depth: 0.5mm; RoHS Compliant: Yes; Min Operating Temperature: -55°C; Max Operating Temperature: 155°C; Length: 1mm; Series: ERJ-2Rx; Height: 0.35mm; Mount: Surface Mount; Number of Terminations: 2; Features: Automotive AEC-Q200; Contact Plating: Tin; Voltage Rating: 50V; Max Power Dissipation: 100mW; Packaging: Cut Tape; REACH SVHC: No SVHC

## Sheet Connector.SchDoc
size 420 x 297 mm; SheetNumber: 8; SheetTotal: 8
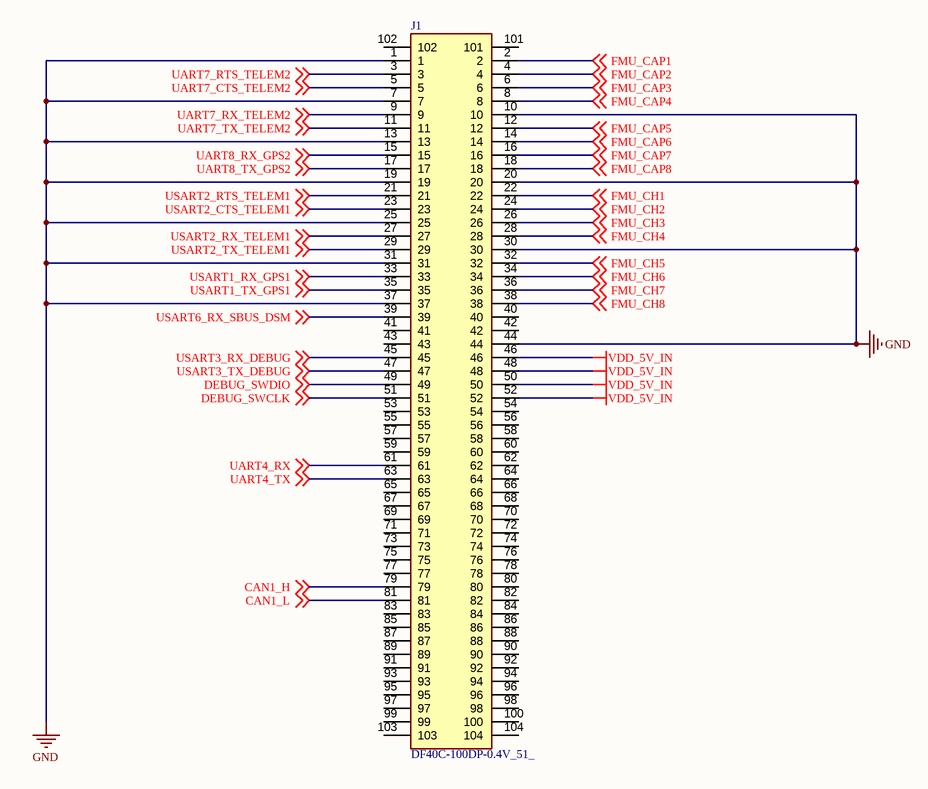
[diagram p7: Connector.SchDoc]

### Parts
J1  DF40C-100DP-0.4V_51_  [DF40C100DP04V51]

### Nets
GND: J1.1 J1.7 J1.10 J1.13 J1.19 J1.20 J1.25 J1.30 J1.31 J1.37 J1.44
VDD_5V_IN: J1.46 J1.48 J1.50 J1.52
CAN1_H: J1.79 ; off-sheet CAN1_H
CAN1_L: J1.81 ; off-sheet CAN1_L
DEBUG_SWCLK: J1.51 ; off-sheet DEBUG_SWCLK
DEBUG_SWDIO: J1.49 ; off-sheet DEBUG_SWDIO
FMU_CAP1: J1.2 ; off-sheet FMU_CAP1
FMU_CAP2: J1.4 ; off-sheet FMU_CAP2
FMU_CAP3: J1.6 ; off-sheet FMU_CAP3
FMU_CAP4: J1.8 ; off-sheet FMU_CAP4
FMU_CAP5: J1.12 ; off-sheet FMU_CAP5
FMU_CAP6: J1.14 ; off-sheet FMU_CAP6
FMU_CAP7: J1.16 ; off-sheet FMU_CAP7
FMU_CAP8: J1.18 ; off-sheet FMU_CAP8
FMU_CH1: J1.22 ; off-sheet FMU_CH1
FMU_CH2: J1.24 ; off-sheet FMU_CH2
FMU_CH3: J1.26 ; off-sheet FMU_CH3
FMU_CH4: J1.28 ; off-sheet FMU_CH4
FMU_CH5: J1.32 ; off-sheet FMU_CH5
FMU_CH6: J1.34 ; off-sheet FMU_CH6
FMU_CH7: J1.36 ; off-sheet FMU_CH7
FMU_CH8: J1.38 ; off-sheet FMU_CH8
UART4_RX: J1.61 ; off-sheet UART4_RX
UART4_TX: J1.63 ; off-sheet UART4_TX
UART7_CTS_TELEM2: J1.5 ; off-sheet UART7_CTS_TELEM2
UART7_RTS_TELEM2: J1.3 ; off-sheet UART7_RTS_TELEM2
UART7_RX_TELEM2: J1.9 ; off-sheet UART7_RX_TELEM2
UART7_TX_TELEM2: J1.11 ; off-sheet UART7_TX_TELEM2
UART8_RX_GPS2: J1.15 ; off-sheet UART8_RX_GPS2
UART8_TX_GPS2: J1.17 ; off-sheet UART8_TX_GPS2
USART1_RX_GPS1: J1.33 ; off-sheet USART1_RX_GPS1
USART1_TX_GPS1: J1.35 ; off-sheet USART1_TX_GPS1
USART2_CTS_TELEM1: J1.23 ; off-sheet USART2_CTS_TELEM1
USART2_RTS_TELEM1: J1.21 ; off-sheet USART2_RTS_TELEM1
USART2_RX_TELEM1: J1.27 ; off-sheet USART2_RX_TELEM1
USART2_TX_TELEM1: J1.29 ; off-sheet USART2_TX_TELEM1
USART3_RX_DEBUG: J1.45 ; off-sheet USART3_RX_DEBUG
USART3_TX_DEBUG: J1.47 ; off-sheet USART3_TX_DEBUG
USART6_RX_SBUS_DSM: J1.39 ; off-sheet USART6_RX_SBUS_DSM

Not connected (* = marked no-connect by the designer): J1 40 41 42 43 53 54 55 56 57 58 59 60 62 64 65 66 67 68 69 70 71 72 73 74 75 76 77 78 80 82 83 84 85 86 87 88 89 90 91 92 93 94 95 96 97 98 99 100 101 102 103 104

### Notes on the sheet
- THIS DOCUMENT AND THE DATA DISCLOSED HEREIN OR
- HEREWITH IS THE PROPERTY OF ALTIUM LIMITED AND MAY
- DWG NO:
- REVISION
- REV:
- DESCRIPTION
- DATE
- APPROVED
- BE FREELY DISTRIBUTED IN WHOLE. NO RIGHTS ARE
- RESERVED OR EXPRESS OR IMPLIED WARANTEE GIVEN.
- ENG:
- APPROVALS
- PROJECT
- DSN:
- CHK:
- REFERENCE DOCUMENTS
- PROJECT REVISION:
- TITLE
- DOCUMENT REVISION:
- DESIGN ITEM:
- BOM:
- FAB DWG:
- PCB DWG:
- ASSY DWG:
- SCALE:
- A3
- SIZE
- CAGE CODE
- FILE NAME
- DWG NO.
- SHEET
- OF
- REV

### Library data of the parts
J1 = CMP-002-00076-1: HIROSE(HRS) - DF40C-100DP-0.4V(51) - CONN, STACKING, HEADER, 100POS, 2ROW; Geometry.Height: 1mm; Manufacturer_Part_Number: DF40C-100DP-0.4V(51); Design Item ID: DF40C-100DP-0.4V_51_; Source: DF40C-100DP-0.4V_51_.SchLib; Mouser Price/Stock: https://www.mouser.co.uk/ProductDetail/Hirose-Connector/DF40C-100DP-0.4V51?qs=eDUdFcBPps2TxbrE27%2Ff2A%3D%3D; Mouser Part Number: 798-DF40C100DP0.4V51; Datasheet Link: https://datasheet.datasheetarchive.com/originals/distributors/SFDatasheet-7/sf-000141247.pdf; Manufacturer_Name: Hirose